# Altium project EVT_SYS_CARRIER.PrjPcb
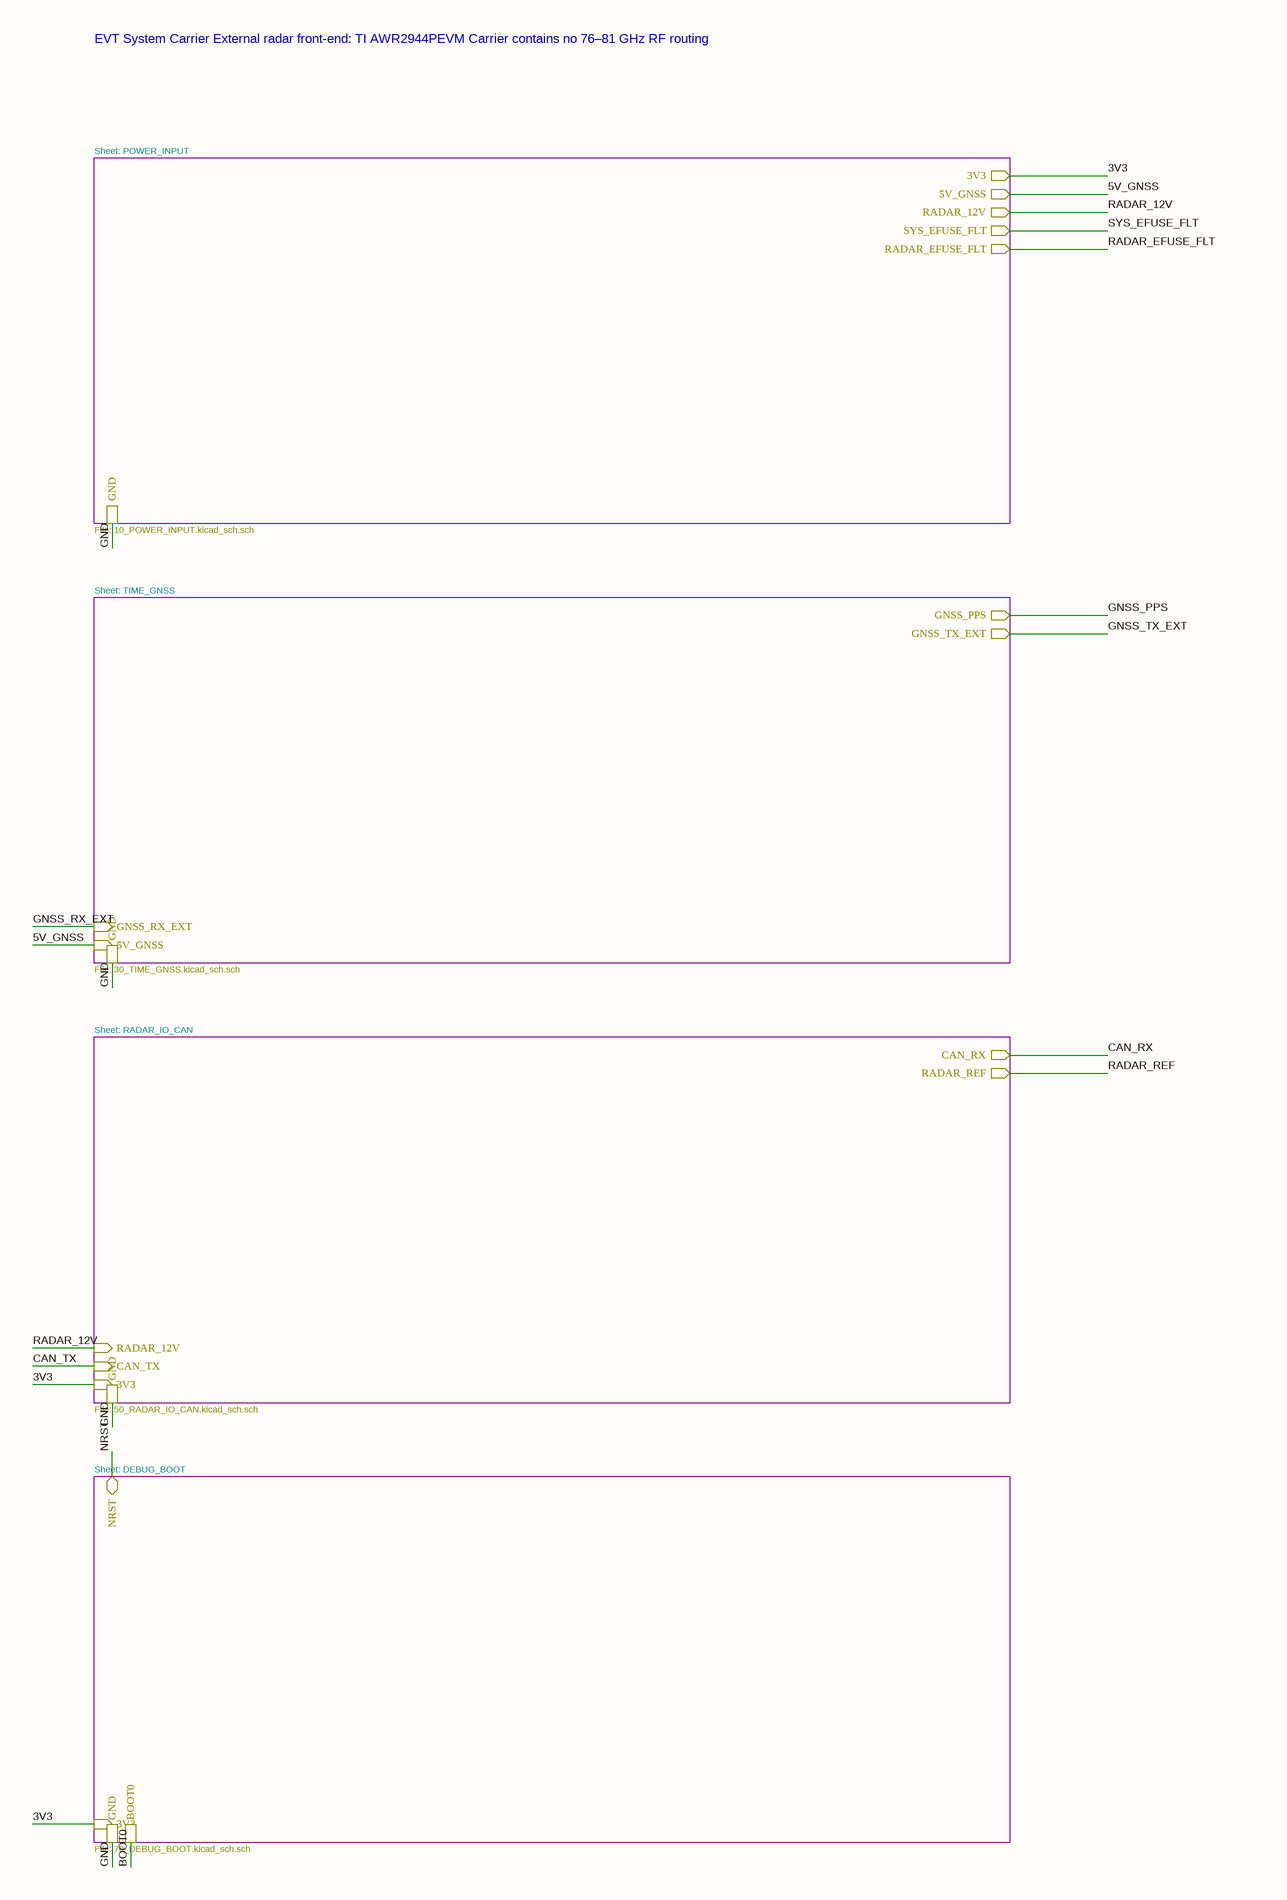
[diagram p0: EVT_SYS_CARRIER.SchDoc, left]
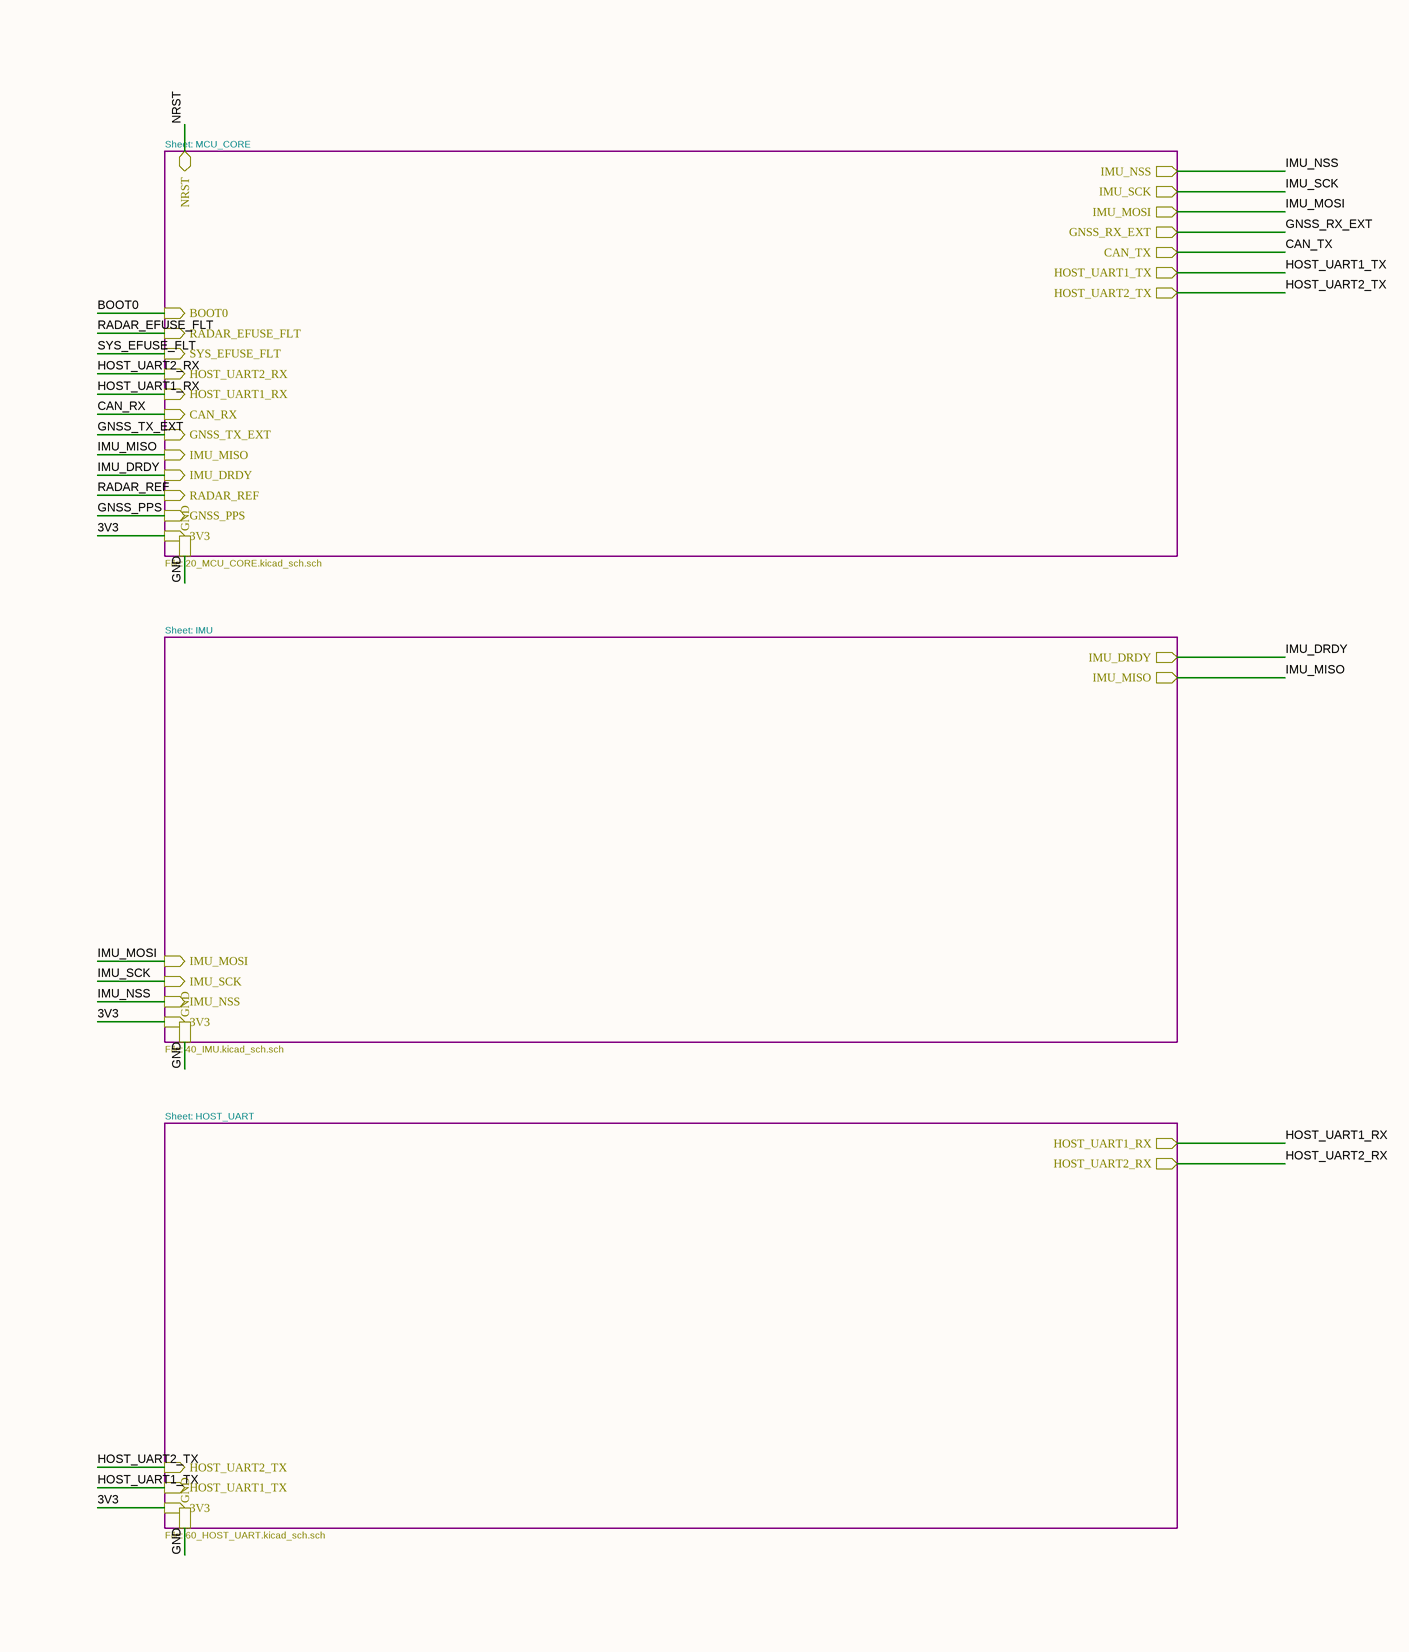
[diagram p1: EVT_SYS_CARRIER.SchDoc, right]
8 sheets, 112 parts. Net scope: hierarchical (ports join the sheet entries above them; power ports are global).
Board file: EVT_SYS_CARRIER.PcbDoc
Sheets:
  EVT_SYS_CARRIER.SchDoc
    POWER_INPUT = 10_POWER_INPUT.SchDoc
    MCU_CORE = 20_MCU_CORE.SchDoc
    TIME_GNSS = 30_TIME_GNSS.SchDoc
    IMU = 40_IMU.SchDoc
    RADAR_IO_CAN = 50_RADAR_IO_CAN.SchDoc
    HOST_UART = 60_HOST_UART.SchDoc
    DEBUG_BOOT = 70_DEBUG_BOOT.SchDoc

## Sheet EVT_SYS_CARRIER.SchDoc
size 594 x 420 mm

### Sub-sheets
DEBUG_BOOT = 70_DEBUG_BOOT.SchDoc: 3V3 (in), GND, NRST (bidir), BOOT0
HOST_UART = 60_HOST_UART.SchDoc: 3V3 (in), GND, HOST_UART1_TX (in), HOST_UART1_RX (out), HOST_UART2_TX (in), HOST_UART2_RX (out)
IMU = 40_IMU.SchDoc: 3V3 (in), GND, IMU_DRDY (out), IMU_NSS (in), IMU_SCK (in), IMU_MISO (out), IMU_MOSI (in)
MCU_CORE = 20_MCU_CORE.SchDoc: 3V3 (in), GND, GNSS_PPS (in), RADAR_REF (in), IMU_DRDY (in), IMU_NSS (out), IMU_SCK (out), IMU_MISO (in), IMU_MOSI (out), GNSS_RX_EXT (out), GNSS_TX_EXT (in), CAN_RX (in), CAN_TX (out), HOST_UART1_TX (out), HOST_UART1_RX (in), HOST_UART2_TX (out), HOST_UART2_RX (in), SYS_EFUSE_FLT (in), RADAR_EFUSE_FLT (in), NRST (bidir), BOOT0 (in)
POWER_INPUT = 10_POWER_INPUT.SchDoc: 3V3 (out), 5V_GNSS (out), RADAR_12V (out), SYS_EFUSE_FLT (out), RADAR_EFUSE_FLT (out), GND
RADAR_IO_CAN = 50_RADAR_IO_CAN.SchDoc: 3V3 (in), GND, CAN_TX (in), CAN_RX (out), RADAR_REF (out), RADAR_12V (in)
TIME_GNSS = 30_TIME_GNSS.SchDoc: 5V_GNSS (in), GND, GNSS_PPS (out), GNSS_TX_EXT (out), GNSS_RX_EXT (in)

### Nets
3V3: sheet POWER_INPUT/3V3, sheet MCU_CORE/3V3, sheet IMU/3V3, sheet RADAR_IO_CAN/3V3, sheet HOST_UART/3V3, sheet DEBUG_BOOT/3V3
5V_GNSS: sheet POWER_INPUT/5V_GNSS, sheet TIME_GNSS/5V_GNSS
BOOT0: sheet MCU_CORE/BOOT0, sheet DEBUG_BOOT/BOOT0
CAN_RX: sheet MCU_CORE/CAN_RX, sheet RADAR_IO_CAN/CAN_RX
CAN_TX: sheet MCU_CORE/CAN_TX, sheet RADAR_IO_CAN/CAN_TX
GND: sheet POWER_INPUT/GND, sheet MCU_CORE/GND, sheet TIME_GNSS/GND, sheet IMU/GND, sheet RADAR_IO_CAN/GND, sheet HOST_UART/GND, sheet DEBUG_BOOT/GND
GNSS_PPS: sheet MCU_CORE/GNSS_PPS, sheet TIME_GNSS/GNSS_PPS
GNSS_RX_EXT: sheet MCU_CORE/GNSS_RX_EXT, sheet TIME_GNSS/GNSS_RX_EXT
GNSS_TX_EXT: sheet MCU_CORE/GNSS_TX_EXT, sheet TIME_GNSS/GNSS_TX_EXT
HOST_UART1_RX: sheet MCU_CORE/HOST_UART1_RX, sheet HOST_UART/HOST_UART1_RX
HOST_UART1_TX: sheet MCU_CORE/HOST_UART1_TX, sheet HOST_UART/HOST_UART1_TX
HOST_UART2_RX: sheet MCU_CORE/HOST_UART2_RX, sheet HOST_UART/HOST_UART2_RX
HOST_UART2_TX: sheet MCU_CORE/HOST_UART2_TX, sheet HOST_UART/HOST_UART2_TX
IMU_DRDY: sheet MCU_CORE/IMU_DRDY, sheet IMU/IMU_DRDY
IMU_MISO: sheet MCU_CORE/IMU_MISO, sheet IMU/IMU_MISO
IMU_MOSI: sheet MCU_CORE/IMU_MOSI, sheet IMU/IMU_MOSI
IMU_NSS: sheet MCU_CORE/IMU_NSS, sheet IMU/IMU_NSS
IMU_SCK: sheet MCU_CORE/IMU_SCK, sheet IMU/IMU_SCK
NRST: sheet MCU_CORE/NRST, sheet DEBUG_BOOT/NRST
RADAR_12V: sheet POWER_INPUT/RADAR_12V, sheet RADAR_IO_CAN/RADAR_12V
RADAR_EFUSE_FLT: sheet POWER_INPUT/RADAR_EFUSE_FLT, sheet MCU_CORE/RADAR_EFUSE_FLT
RADAR_REF: sheet MCU_CORE/RADAR_REF, sheet RADAR_IO_CAN/RADAR_REF
SYS_EFUSE_FLT: sheet POWER_INPUT/SYS_EFUSE_FLT, sheet MCU_CORE/SYS_EFUSE_FLT

### Notes on the sheet
- EVT System Carrier
  External radar front-end: TI AWR2944PEVM
  Carrier contains no 76–81 GHz RF routing
- Sheet: POWER_INPUT
- Sheet: MCU_CORE
- File: 10_POWER_INPUT.kicad_sch.sch
- File: 20_MCU_CORE.kicad_sch.sch
- Sheet: TIME_GNSS
- Sheet: IMU
- File: 30_TIME_GNSS.kicad_sch.sch
- File: 40_IMU.kicad_sch.sch
- Sheet: RADAR_IO_CAN
- Sheet: HOST_UART
- File: 50_RADAR_IO_CAN.kicad_sch.sch
- File: 60_HOST_UART.kicad_sch.sch
- Sheet: DEBUG_BOOT
- File: 70_DEBUG_BOOT.kicad_sch.sch
- 1
- 2
- 3
- 4
- 5
- 6
- 7
- 8
- 9
- 10
- 11
- A
- B
- C
- D
- E
- F
- G
- H
- Title: EVT_SYS_CARRIER
- File: EVT_SYS_CARRIER.kicad_sch
- Sheet: /
- KiCad E.D.A.  kicad (5.1.4)-1
- Size: A2
- Date:
- Rev:
- Id: 1/1

## Sheet 10_POWER_INPUT.SchDoc
size 420 x 297 mm
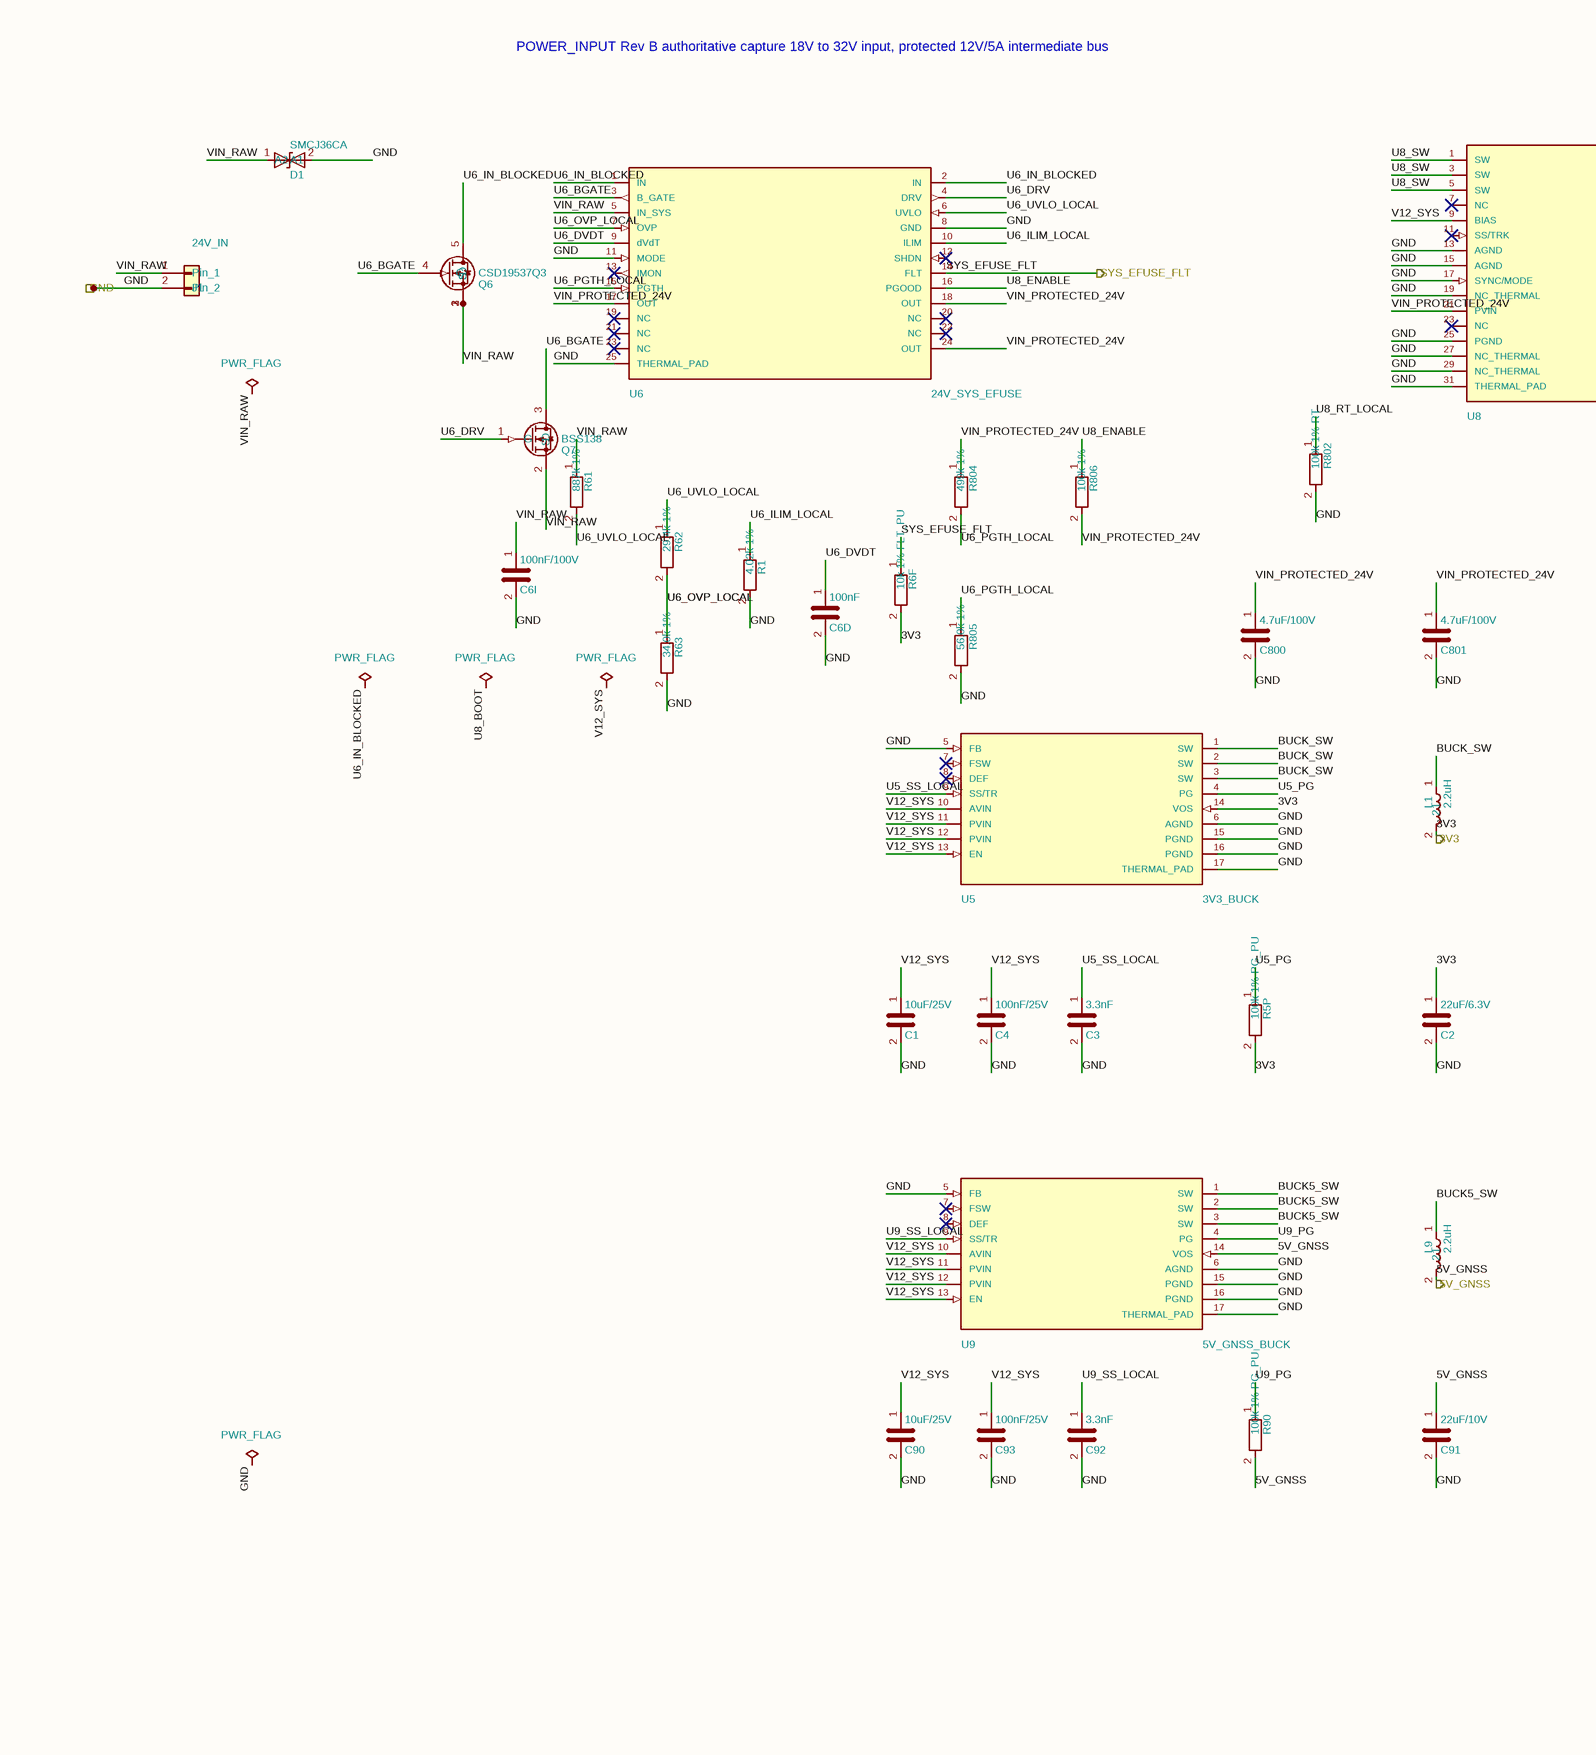
[diagram p2: 10_POWER_INPUT.SchDoc, left]
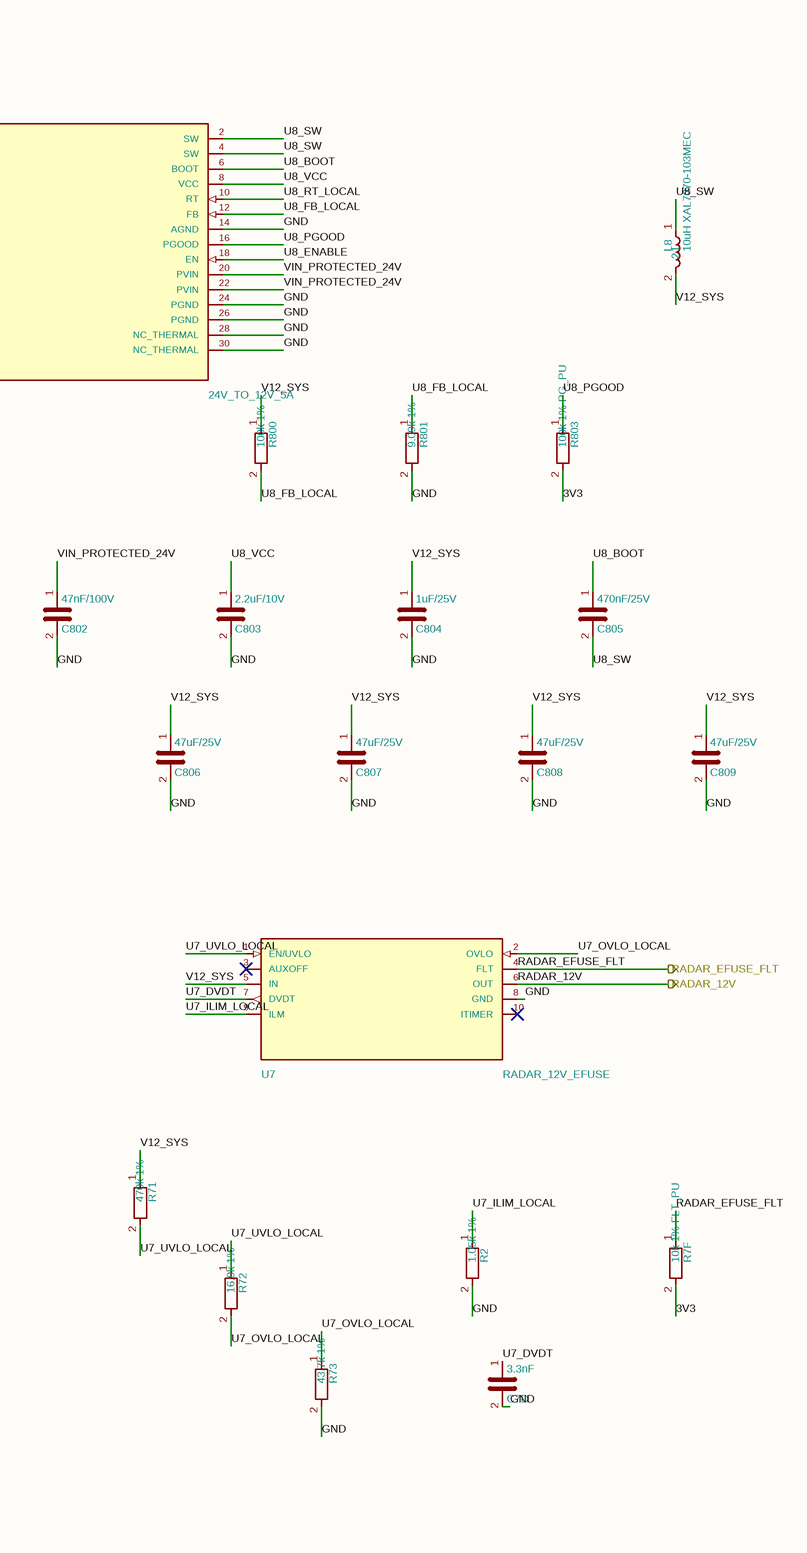
[diagram p3: 10_POWER_INPUT.SchDoc, right]

### Parts
#FLG0201  PWR_FLAG  (graphical)
#FLG0202  PWR_FLAG  (graphical)
#FLG0203  PWR_FLAG  (graphical)
#FLG0204  PWR_FLAG  (graphical)
#FLG0205  PWR_FLAG  (graphical)
C1  10uF/25V  [C_1206_3216Metric]
C2  22uF/6.3V  [C_1206_3216Metric]
C3  3.3nF  [C_0603_1608Metric]
C4  100nF/25V  [C_0603_1608Metric]
C6D  100nF  [C_0603_1608Metric]
C6I  100nF/100V  [C_0603_1608Metric]
C7D  3.3nF  [C_0603_1608Metric]
C90  10uF/25V  [C_1206_3216Metric]
C91  22uF/10V  [C_1206_3216Metric]
C92  3.3nF  [C_0603_1608Metric]
C93  100nF/25V  [C_0603_1608Metric]
C800  4.7uF/100V  [C_1210_3225Metric]
C801  4.7uF/100V  [C_1210_3225Metric]
C802  47nF/100V  [C_0603_1608Metric]
C803  2.2uF/10V  [C_0603_1608Metric]
C804  1uF/25V  [C_0603_1608Metric]
C805  470nF/25V  [C_0603_1608Metric]
C806  47uF/25V  [C_1210_3225Metric]
C807  47uF/25V  [C_1210_3225Metric]
C808  47uF/25V  [C_1210_3225Metric]
C809  47uF/25V  [C_1210_3225Metric]
D1  SMCJ36CA  [D_SMC]
J1  24V_IN  [Molex_43650-0200_RA_THT_2P]
L1  2.2uH  [Coilcraft_XFL4020_4x4]
L8  10uH XAL7070-103MEC  [L_Coilcraft_XAL7070-XXX]
L9  2.2uH  [Coilcraft_XFL4020_4x4]
Q6  CSD19537Q3  [VSON-8_3.3x3.3mm_P0.65mm_NexFET]
Q7  BSS138  [SOT-23]
R1  4.02k 1%  [R_0603_1608Metric]
R2  1.05k 1%  [R_0603_1608Metric]
R5P  100k 1% PG_PU  [R_0603_1608Metric]
R6F  10k 1% FLT_PU  [R_0603_1608Metric]
R7F  10k 1% FLT_PU  [R_0603_1608Metric]
R61  887k 1%  [R_0603_1608Metric]
R62  29.4k 1%  [R_0603_1608Metric]
R63  34.0k 1%  [R_0603_1608Metric]
R71  470k 1%  [R_0603_1608Metric]
R72  16.9k 1%  [R_0603_1608Metric]
R73  43.7k 1%  [R_0603_1608Metric]
R90  100k 1% PG_PU  [R_0603_1608Metric]
R800  100k 1%  [R_0603_1608Metric]
R801  9.09k 1%  [R_0603_1608Metric]
R802  100k 1% RT  [R_0603_1608Metric]
R803  100k 1% PG_PU  [R_0603_1608Metric]
R804  499k 1%  [R_0603_1608Metric]
R805  56.0k 1%  [R_0603_1608Metric]
R806  100k 1%  [R_0603_1608Metric]
U5  3V3_BUCK  [VQFN-16-1EP_3x3mm_P0.5mm_EP1.68x1.68mm]
U6  24V_SYS_EFUSE  [Texas_RGE0024C_VQFN-24-1EP_4x4mm_P0.5mm_EP2.1x2.1mm]
U7  RADAR_12V_EFUSE  [TPS259470A_RPW0010A_VQFN-HR-10_2x2mm_P0.475mm]
U8  24V_TO_12V_5A  [Texas_RNP0030B_WQFN-30-1EP_4x6mm_P0.5mm_EP1.8x4.5mm_ThermalVias]
U9  5V_GNSS_BUCK  [VQFN-16-1EP_3x3mm_P0.5mm_EP1.68x1.68mm]

### Ports
3V3 (out), 5V_GNSS (out), GND, RADAR_12V (out), RADAR_EFUSE_FLT (out), SYS_EFUSE_FLT (out)

### Nets
3V3: C2.1 L1.2 R5P.2 R6F.2 R7F.2 R803.2 U5.14(VOS) ; port 3V3
5V_GNSS: C91.1 L9.2 R90.2 U9.14(VOS) ; port 5V_GNSS
BUCK5_SW: L9.1 U9.1(SW) U9.2(SW) U9.3(SW)
BUCK_SW: L1.1 U5.1(SW) U5.2(SW) U5.3(SW)
GND: #FLG0202.1 C1.2 C2.2 C3.2 C4.2 C6D.2 C6I.2 C7D.2 C90.2 C91.2 C92.2 C93.2 C800.2 C801.2 C802.2 C803.2 C804.2 C806.2 C807.2 C808.2 C809.2 D1.2(A2) J1.2(Pin_2) R1.2 R2.2 R63.2 R73.2 R801.2 R802.2 R805.2 U5.5(FB) U5.6(AGND) U5.15(PGND) U5.16(PGND) U5.17(THERMAL_PAD) U6.8(GND) U6.11(MODE) U6.25(THERMAL_PAD) U7.8(GND) U8.13(AGND) U8.14(AGND) U8.15(AGND) U8.17(SYNC/MODE) U8.19(NC_THERMAL) U8.24(PGND) U8.25(PGND) U8.26(PGND) U8.27(NC_THERMAL) U8.28(NC_THERMAL) U8.29(NC_THERMAL) U8.30(NC_THERMAL) U8.31(THERMAL_PAD) U9.5(FB) U9.6(AGND) U9.15(PGND) U9.16(PGND) U9.17(THERMAL_PAD) ; port GND
RADAR_12V: U7.6(OUT) ; port RADAR_12V
RADAR_EFUSE_FLT: R7F.1 U7.4(FLT) ; port RADAR_EFUSE_FLT
SYS_EFUSE_FLT: R6F.1 U6.14(FLT) ; port SYS_EFUSE_FLT
U5_PG: R5P.1 U5.4(PG)
U5_SS_LOCAL: C3.1 U5.9(SS/TR)
U6_BGATE: Q6.4(G) Q7.3(D) U6.3(B_GATE)
U6_DRV: Q7.1(G) U6.4(DRV)
U6_DVDT: C6D.1 U6.9(dVdT)
U6_ILIM_LOCAL: R1.1 U6.10(ILIM)
U6_IN_BLOCKED: #FLG0203.1 Q6.5(D) U6.1(IN) U6.2(IN)
U6_OVP_LOCAL: R62.2 R63.1 U6.7(OVP)
U6_PGTH_LOCAL: R804.2 R805.1 U6.15(PGTH)
U6_UVLO_LOCAL: R61.2 R62.1 U6.6(UVLO)
U7_DVDT: C7D.1 U7.7(DVDT)
U7_ILIM_LOCAL: R2.1 U7.9(ILM)
U7_OVLO_LOCAL: R72.2 R73.1 U7.2(OVLO)
U7_UVLO_LOCAL: R71.2 R72.1 U7.1(EN/UVLO)
U8_BOOT: #FLG0204.1 C805.1 U8.6(BOOT)
U8_ENABLE: R806.1 U6.16(PGOOD) U8.18(EN)
U8_FB_LOCAL: R800.2 R801.1 U8.12(FB)
U8_PGOOD: R803.1 U8.16(PGOOD)
U8_RT_LOCAL: R802.1 U8.10(RT)
U8_SW: C805.2 L8.1 U8.1(SW) U8.2(SW) U8.3(SW) U8.4(SW) U8.5(SW)
U8_VCC: C803.1 U8.8(VCC)
U9_PG: R90.1 U9.4(PG)
U9_SS_LOCAL: C92.1 U9.9(SS/TR)
V12_SYS: #FLG0205.1 C1.1 C4.1 C90.1 C93.1 C804.1 C806.1 C807.1 C808.1 C809.1 L8.2 R71.1 R800.1 U5.10(AVIN) U5.11(PVIN) U5.12(PVIN) U5.13(EN) U7.5(IN) U8.9(BIAS) U9.10(AVIN) U9.11(PVIN) U9.12(PVIN) U9.13(EN)
VIN_PROTECTED_24V: C800.1 C801.1 C802.1 R804.1 R806.2 U6.17(OUT) U6.18(OUT) U6.24(OUT) U8.20(PVIN) U8.21(PVIN) U8.22(PVIN)
VIN_RAW: #FLG0201.1 C6I.1 D1.1(A1) J1.1(Pin_1) Q6.1(S) Q6.2(S) Q6.3(S) Q7.2(S) R61.1 U6.5(IN_SYS)

Not connected (* = marked no-connect by the designer): U5 7(FSW)* 8(DEF)*; U6 12(SHDN)* 13(IMON)* 19(NC)* 20(NC)* 21(NC)* 22(NC)* 23(NC)*; U7 3(AUXOFF)* 10(ITIMER)*; U8 7(NC)* 11(SS/TRK)* 23(NC)*; U9 7(FSW)* 8(DEF)*

### Notes on the sheet
- POWER_INPUT Rev B authoritative capture
  18V to 32V input, protected 12V/5A intermediate bus
- 1
- 2
- 3
- 4
- 5
- 6
- 7
- 8
- A
- B
- C
- D
- E
- Title: EVT_SYS_CARRIER
- File: 10_POWER_INPUT.kicad_sch
- Sheet: /
- F
- KiCad E.D.A.  kicad (5.1.4)-1
- Size: A3
- Date:
- Rev:
- Id: 1/1

### Library data of the parts
#FLG0201 #FLG0202 #FLG0203 #FLG0204 #FLG0205 = PWR_FLAG: hierarchy_path: /66980d89-56fb-4772-93a7-06a61d388399/6dd53468-99c2-4197-8bec-3687fb851dcd; Value: PWR_FLAG
C1 C90 = C: MPN: 10uF_25V_X7R; hierarchy_path: /66980d89-56fb-4772-93a7-06a61d388399/6dd53468-99c2-4197-8bec-3687fb851dcd; Value: 10uF/25V; Footprint: Capacitor_SMD:C_1206_3216Metric
C2 = C: MPN: 22uF_6.3V_X7R; hierarchy_path: /66980d89-56fb-4772-93a7-06a61d388399/6dd53468-99c2-4197-8bec-3687fb851dcd; Value: 22uF/6.3V; Footprint: Capacitor_SMD:C_1206_3216Metric
C3 C7D C92 = C: MPN: 3.3nF_X7R; hierarchy_path: /66980d89-56fb-4772-93a7-06a61d388399/6dd53468-99c2-4197-8bec-3687fb851dcd; Value: 3.3nF; Footprint: Capacitor_SMD:C_0603_1608Metric
C4 C6D C93 = C: MPN: 100nF_25V_X7R; hierarchy_path: /66980d89-56fb-4772-93a7-06a61d388399/6dd53468-99c2-4197-8bec-3687fb851dcd; Footprint: Capacitor_SMD:C_0603_1608Metric
  C4 C93: Value: 100nF/25V
  C6D: Value: 100nF
C6I = C: MPN: 100nF_100V_X7R; hierarchy_path: /66980d89-56fb-4772-93a7-06a61d388399/6dd53468-99c2-4197-8bec-3687fb851dcd; Value: 100nF/100V; Footprint: Capacitor_SMD:C_0603_1608Metric
C91 = C: MPN: 22uF_10V_X7R; hierarchy_path: /66980d89-56fb-4772-93a7-06a61d388399/6dd53468-99c2-4197-8bec-3687fb851dcd; Value: 22uF/10V; Footprint: Capacitor_SMD:C_1206_3216Metric
C800 C801 = C: MPN: C3225X7S2A475K200AB; hierarchy_path: /66980d89-56fb-4772-93a7-06a61d388399/6dd53468-99c2-4197-8bec-3687fb851dcd; Value: 4.7uF/100V; Footprint: Capacitor_SMD:C_1210_3225Metric
C802 = C: MPN: 47nF_100V_X7R; hierarchy_path: /66980d89-56fb-4772-93a7-06a61d388399/6dd53468-99c2-4197-8bec-3687fb851dcd; Value: 47nF/100V; Footprint: Capacitor_SMD:C_0603_1608Metric
C803 = C: MPN: 2.2uF_10V_X7R; hierarchy_path: /66980d89-56fb-4772-93a7-06a61d388399/6dd53468-99c2-4197-8bec-3687fb851dcd; Value: 2.2uF/10V; Footprint: Capacitor_SMD:C_0603_1608Metric
C804 = C: MPN: 1uF_25V_X7R; hierarchy_path: /66980d89-56fb-4772-93a7-06a61d388399/6dd53468-99c2-4197-8bec-3687fb851dcd; Value: 1uF/25V; Footprint: Capacitor_SMD:C_0603_1608Metric
C805 = C: MPN: 470nF_25V_X7R; hierarchy_path: /66980d89-56fb-4772-93a7-06a61d388399/6dd53468-99c2-4197-8bec-3687fb851dcd; Value: 470nF/25V; Footprint: Capacitor_SMD:C_0603_1608Metric
C806-C809 = C: MPN: 47uF_25V_X7R; hierarchy_path: /66980d89-56fb-4772-93a7-06a61d388399/6dd53468-99c2-4197-8bec-3687fb851dcd; Value: 47uF/25V; Footprint: Capacitor_SMD:C_1210_3225Metric
D1 = D_TVS: hierarchy_path: /66980d89-56fb-4772-93a7-06a61d388399/6dd53468-99c2-4197-8bec-3687fb851dcd; MPN: SMCJ36CA; Value: SMCJ36CA; Footprint: Diode_SMD:D_SMC
J1 = Conn_01x02: MPN: 43650-0200; hierarchy_path: /66980d89-56fb-4772-93a7-06a61d388399/6dd53468-99c2-4197-8bec-3687fb851dcd; Value: 24V_IN; Footprint: SystemCarrier_Altium:Molex_43650-0200_RA_THT_2P
L1 L9 = L: MPN: XFL4020-222MEC; hierarchy_path: /66980d89-56fb-4772-93a7-06a61d388399/6dd53468-99c2-4197-8bec-3687fb851dcd; Value: 2.2uH; Footprint: SystemCarrier_Altium:Coilcraft_XFL4020_4x4
L8 = L: hierarchy_path: /66980d89-56fb-4772-93a7-06a61d388399/6dd53468-99c2-4197-8bec-3687fb851dcd; MPN: XAL7070-103MEC; Value: 10uH XAL7070-103MEC; Footprint: Inductor_SMD:L_Coilcraft_XAL7070-XXX
Q6 = CSD19537Q3: hierarchy_path: /66980d89-56fb-4772-93a7-06a61d388399/6dd53468-99c2-4197-8bec-3687fb851dcd; MPN: CSD19537Q3; Value: CSD19537Q3; Footprint: Package_SON:VSON-8_3.3x3.3mm_P0.65mm_NexFET
Q7 = BSS138: hierarchy_path: /66980d89-56fb-4772-93a7-06a61d388399/6dd53468-99c2-4197-8bec-3687fb851dcd; MPN: BSS138; Value: BSS138; Footprint: Package_TO_SOT_SMD:SOT-23
R1 = R: MPN: 4.02k_1%; hierarchy_path: /66980d89-56fb-4772-93a7-06a61d388399/6dd53468-99c2-4197-8bec-3687fb851dcd; Value: 4.02k 1%; Footprint: Resistor_SMD:R_0603_1608Metric
R2 = R: MPN: 1.05k_1%; hierarchy_path: /66980d89-56fb-4772-93a7-06a61d388399/6dd53468-99c2-4197-8bec-3687fb851dcd; Value: 1.05k 1%; Footprint: Resistor_SMD:R_0603_1608Metric
R5P R90 R800 R802 R803 R806 = R: MPN: 100k_1%; hierarchy_path: /66980d89-56fb-4772-93a7-06a61d388399/6dd53468-99c2-4197-8bec-3687fb851dcd; Footprint: Resistor_SMD:R_0603_1608Metric
  R5P R90 R803: Value: 100k 1% PG_PU
  R800 R806: Value: 100k 1%
  R802: Value: 100k 1% RT
R6F R7F = R: MPN: 10k_1%; hierarchy_path: /66980d89-56fb-4772-93a7-06a61d388399/6dd53468-99c2-4197-8bec-3687fb851dcd; Value: 10k 1% FLT_PU; Footprint: Resistor_SMD:R_0603_1608Metric
R61 = R: MPN: 887k_1%; hierarchy_path: /66980d89-56fb-4772-93a7-06a61d388399/6dd53468-99c2-4197-8bec-3687fb851dcd; Value: 887k 1%; Footprint: Resistor_SMD:R_0603_1608Metric
R62 = R: MPN: 29.4k_1%; hierarchy_path: /66980d89-56fb-4772-93a7-06a61d388399/6dd53468-99c2-4197-8bec-3687fb851dcd; Value: 29.4k 1%; Footprint: Resistor_SMD:R_0603_1608Metric
R63 = R: MPN: 34.0k_1%; hierarchy_path: /66980d89-56fb-4772-93a7-06a61d388399/6dd53468-99c2-4197-8bec-3687fb851dcd; Value: 34.0k 1%; Footprint: Resistor_SMD:R_0603_1608Metric
R71 = R: MPN: 470k_1%; hierarchy_path: /66980d89-56fb-4772-93a7-06a61d388399/6dd53468-99c2-4197-8bec-3687fb851dcd; Value: 470k 1%; Footprint: Resistor_SMD:R_0603_1608Metric
R72 = R: MPN: 16.9k_1%; hierarchy_path: /66980d89-56fb-4772-93a7-06a61d388399/6dd53468-99c2-4197-8bec-3687fb851dcd; Value: 16.9k 1%; Footprint: Resistor_SMD:R_0603_1608Metric
R73 = R: MPN: 43.7k_1%; hierarchy_path: /66980d89-56fb-4772-93a7-06a61d388399/6dd53468-99c2-4197-8bec-3687fb851dcd; Value: 43.7k 1%; Footprint: Resistor_SMD:R_0603_1608Metric
R801 = R: MPN: 9.09k_1%; hierarchy_path: /66980d89-56fb-4772-93a7-06a61d388399/6dd53468-99c2-4197-8bec-3687fb851dcd; Value: 9.09k 1%; Footprint: Resistor_SMD:R_0603_1608Metric
R804 = R: MPN: 499k_1%; hierarchy_path: /66980d89-56fb-4772-93a7-06a61d388399/6dd53468-99c2-4197-8bec-3687fb851dcd; Value: 499k 1%; Footprint: Resistor_SMD:R_0603_1608Metric
R805 = R: MPN: 56.0k_1%; hierarchy_path: /66980d89-56fb-4772-93a7-06a61d388399/6dd53468-99c2-4197-8bec-3687fb851dcd; Value: 56.0k 1%; Footprint: Resistor_SMD:R_0603_1608Metric
U5 = TPS62132RGTR: Capture_Status: LOCAL_CONTRACT_SYMBOL; hierarchy_path: /66980d89-56fb-4772-93a7-06a61d388399/6dd53468-99c2-4197-8bec-3687fb851dcd; MPN: TPS62132RGTR; Value: 3V3_BUCK; Footprint: Package_DFN_QFN:VQFN-16-1EP_3x3mm_P0.5mm_EP1.68x1.68mm
U6 = TPS26630RGER: Capture_Status: LOCAL_CONTRACT_SYMBOL; hierarchy_path: /66980d89-56fb-4772-93a7-06a61d388399/6dd53468-99c2-4197-8bec-3687fb851dcd; MPN: TPS26630RGER; Value: 24V_SYS_EFUSE; Footprint: Package_DFN_QFN:Texas_RGE0024C_VQFN-24-1EP_4x4mm_P0.5mm_EP2.1x2.1mm
U7 = TPS259470ARPWR: Capture_Status: LOCAL_CONTRACT_SYMBOL; hierarchy_path: /66980d89-56fb-4772-93a7-06a61d388399/6dd53468-99c2-4197-8bec-3687fb851dcd; MPN: TPS259470ARPWR; Value: RADAR_12V_EFUSE; Footprint: SystemCarrier_Local:TPS259470A_RPW0010A_VQFN-HR-10_2x2mm_P0.475mm
U8 = LM76005RNPR: Capture_Status: LOCAL_CONTRACT_SYMBOL; hierarchy_path: /66980d89-56fb-4772-93a7-06a61d388399/6dd53468-99c2-4197-8bec-3687fb851dcd; MPN: LM76005RNPR; Value: 24V_TO_12V_5A; Footprint: Package_DFN_QFN:Texas_RNP0030B_WQFN-30-1EP_4x6mm_P0.5mm_EP1.8x4.5mm_ThermalVias
U9 = TPS62133RGTR: Capture_Status: LOCAL_CONTRACT_SYMBOL; hierarchy_path: /66980d89-56fb-4772-93a7-06a61d388399/6dd53468-99c2-4197-8bec-3687fb851dcd; MPN: TPS62133RGTR; Value: 5V_GNSS_BUCK; Footprint: Package_DFN_QFN:VQFN-16-1EP_3x3mm_P0.5mm_EP1.68x1.68mm

## Sheet 20_MCU_CORE.SchDoc
size 420 x 297 mm
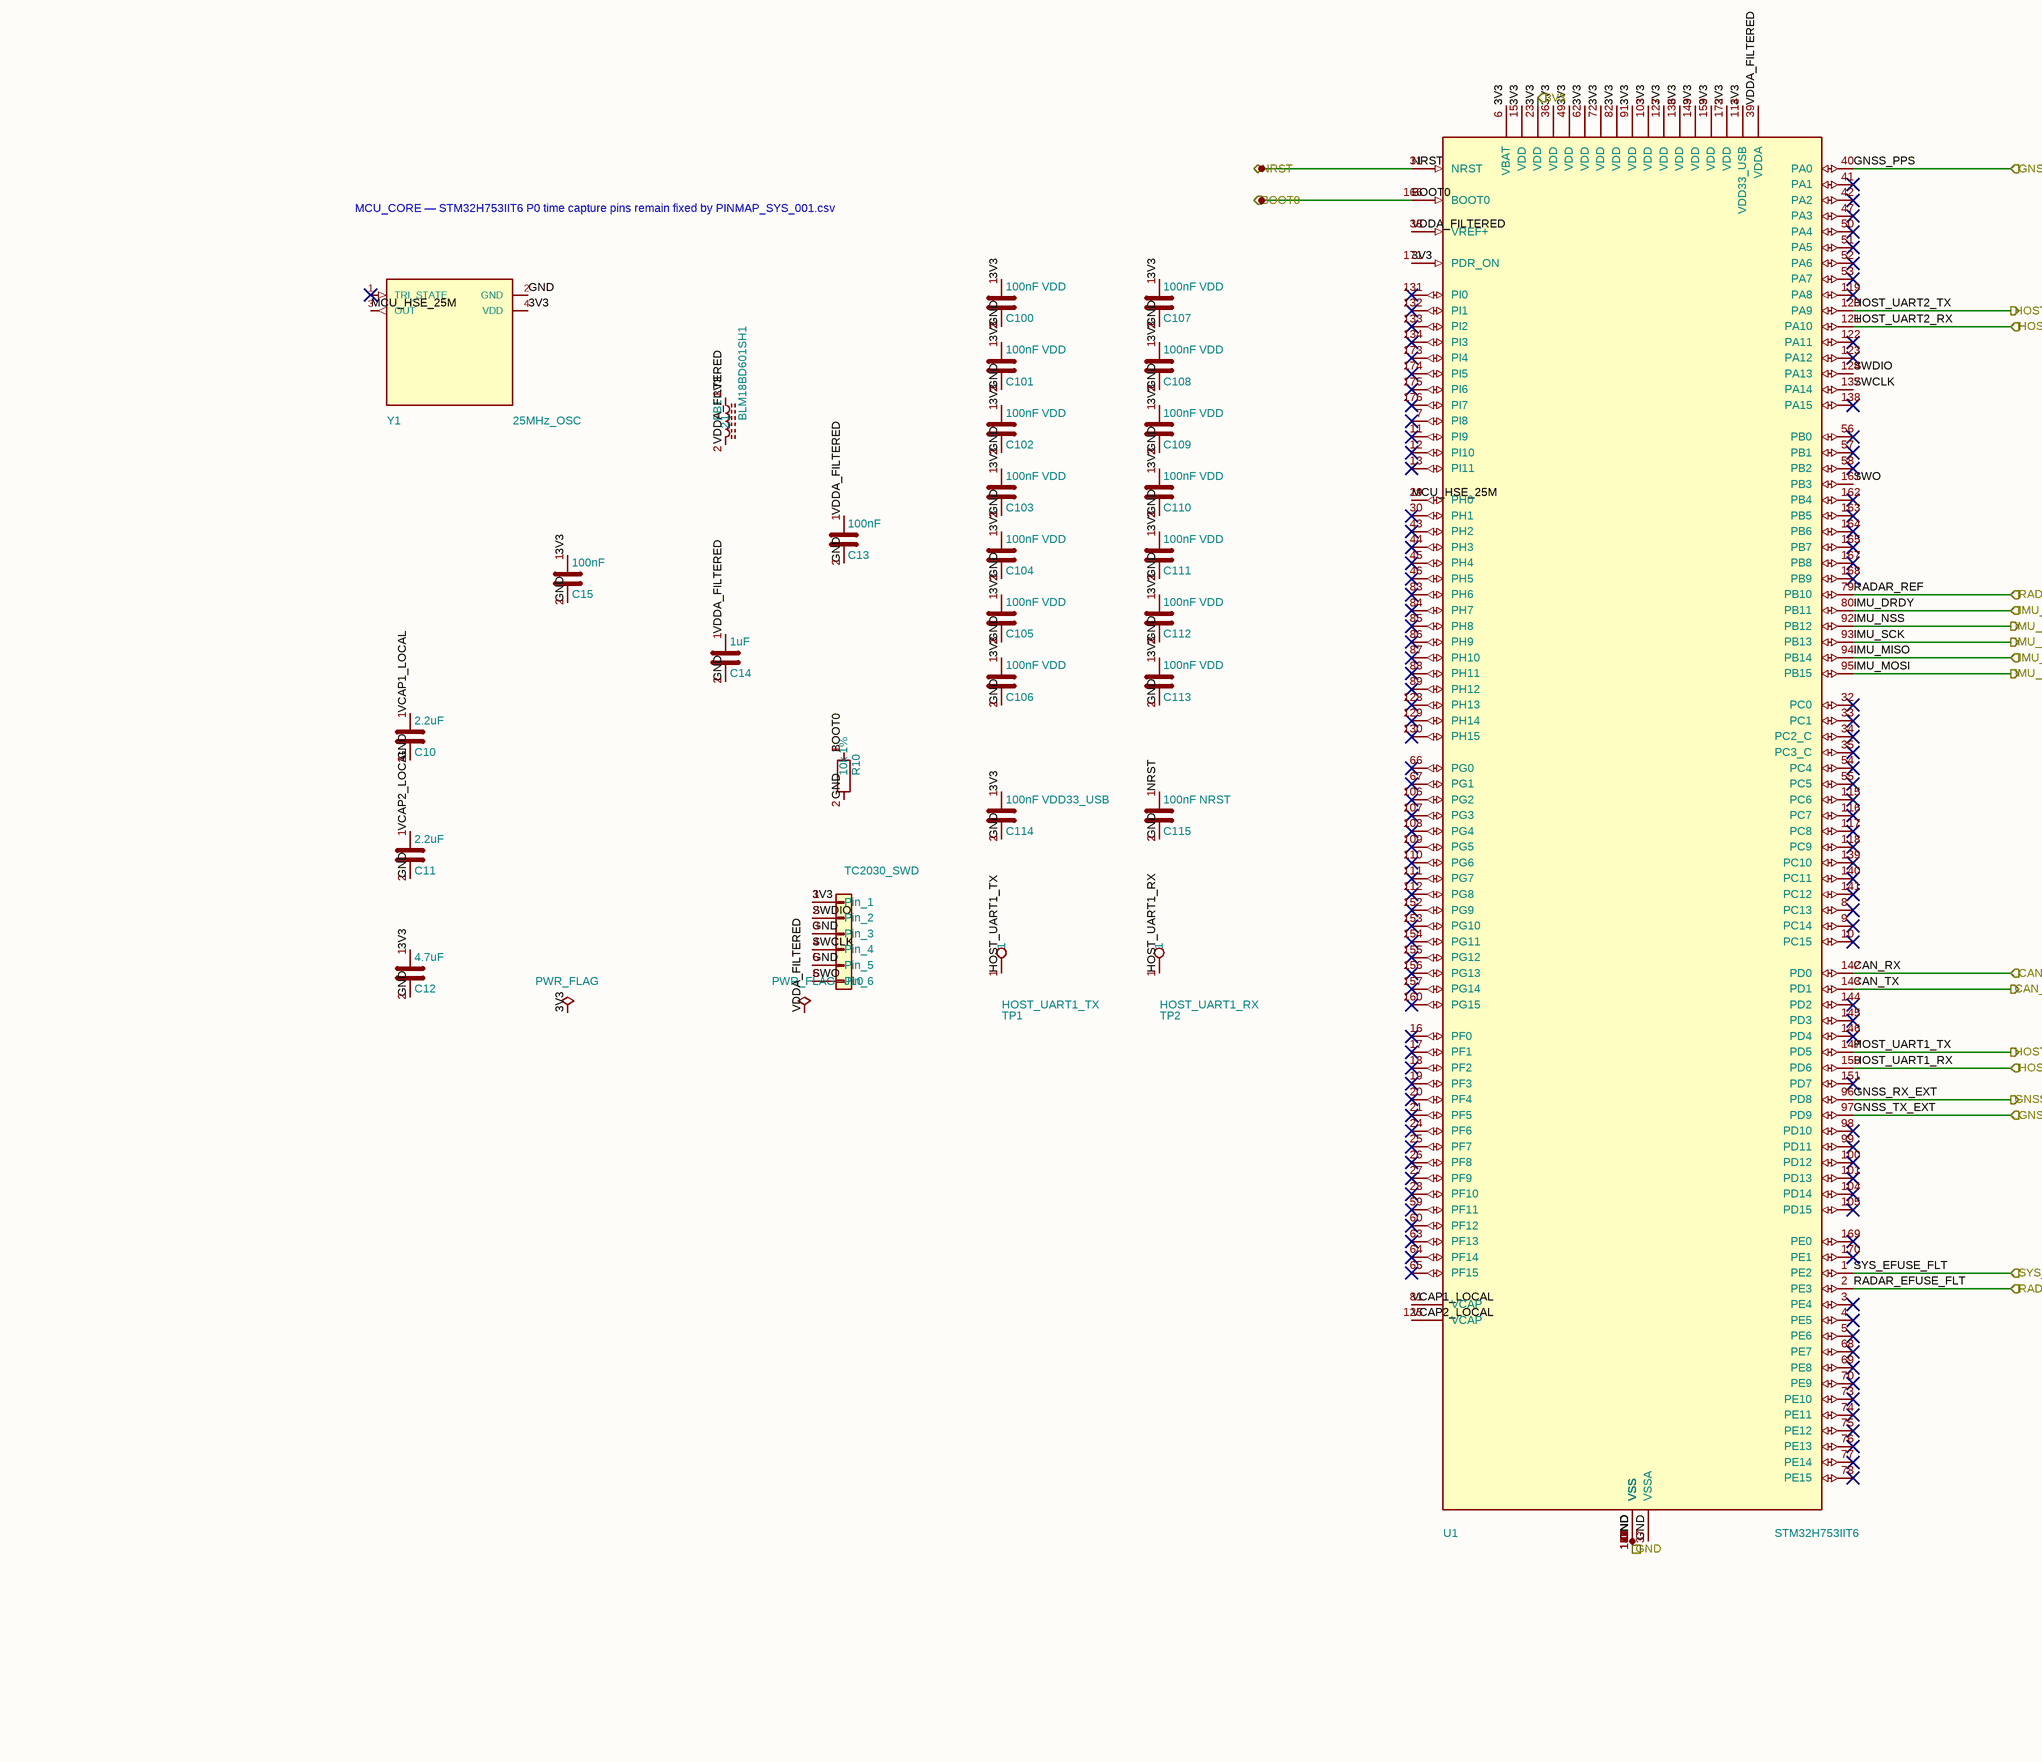
[diagram p4: 20_MCU_CORE.SchDoc]

### Parts
#FLG0101  PWR_FLAG  (graphical)
#FLG0103  PWR_FLAG  (graphical)
C10  2.2uF  [C_0603_1608Metric]
C11  2.2uF  [C_0603_1608Metric]
C12  4.7uF  [C_0805_2012Metric]
C13  100nF  [C_0402_1005Metric]
C14  1uF  [C_0603_1608Metric]
C15  100nF  [C_0402_1005Metric]
C100  100nF VDD  [C_0402_1005Metric]
C101  100nF VDD  [C_0402_1005Metric]
C102  100nF VDD  [C_0402_1005Metric]
C103  100nF VDD  [C_0402_1005Metric]
C104  100nF VDD  [C_0402_1005Metric]
C105  100nF VDD  [C_0402_1005Metric]
C106  100nF VDD  [C_0402_1005Metric]
C107  100nF VDD  [C_0402_1005Metric]
C108  100nF VDD  [C_0402_1005Metric]
C109  100nF VDD  [C_0402_1005Metric]
C110  100nF VDD  [C_0402_1005Metric]
C111  100nF VDD  [C_0402_1005Metric]
C112  100nF VDD  [C_0402_1005Metric]
C113  100nF VDD  [C_0402_1005Metric]
C114  100nF VDD33_USB  [C_0402_1005Metric]
C115  100nF NRST  [C_0402_1005Metric]
FB1  BLM18BD601SH1  [L_0603_1608Metric]
J10  TC2030_SWD  [TagConnect_TC2030_NL]
R10  10k 1%  [R_0603_1608Metric]
TP1  HOST_UART1_TX  [TestPoint_Pad_D1.0mm]
TP2  HOST_UART1_RX  [TestPoint_Pad_D1.0mm]
U1  STM32H753IIT6  [LQFP-176_24x24mm_P0.5mm]
Y1  25MHz_OSC  [Oscillator_SMD_ECS_2520MV-xxx-xx-4Pin_2.5x2.0mm]

### Ports
3V3 (in), BOOT0 (in), CAN_RX (in), CAN_TX (out), GND, GNSS_PPS (in), GNSS_RX_EXT (out), GNSS_TX_EXT (in), HOST_UART1_RX (in), HOST_UART1_TX (out), HOST_UART2_RX (in), HOST_UART2_TX (out), IMU_DRDY (in), IMU_MISO (in), IMU_MOSI (out), IMU_NSS (out), IMU_SCK (out), NRST (bidir), RADAR_EFUSE_FLT (in), RADAR_REF (in), SYS_EFUSE_FLT (in)

### Nets
3V3: #FLG0101.1 C12.1 C15.1 C100.1 C101.1 C102.1 C103.1 C104.1 C105.1 C106.1 C107.1 C108.1 C109.1 C110.1 C111.1 C112.1 C113.1 C114.1 FB1.1 J10.1(Pin_1) U1.6(VBAT) U1.15(VDD) U1.23(VDD) U1.36(VDD) U1.49(VDD) U1.62(VDD) U1.72(VDD) U1.82(VDD) U1.91(VDD) U1.103(VDD) U1.114(VDD33_USB) U1.127(VDD) U1.136(VDD) U1.149(VDD) U1.159(VDD) U1.171(PDR_ON) U1.172(VDD) Y1.4(VDD) ; port 3V3
BOOT0: R10.1 U1.166(BOOT0) ; port BOOT0
CAN_RX: U1.142(PD0) ; port CAN_RX
CAN_TX: U1.143(PD1) ; port CAN_TX
GND: C10.2 C11.2 C12.2 C13.2 C14.2 C15.2 C100.2 C101.2 C102.2 C103.2 C104.2 C105.2 C106.2 C107.2 C108.2 C109.2 C110.2 C111.2 C112.2 C113.2 C114.2 C115.2 J10.3(Pin_3) J10.5(Pin_5) R10.2 U1.14(VSS) U1.22(VSS) U1.37(VSSA) U1.48(VSS) U1.61(VSS) U1.71(VSS) U1.90(VSS) U1.102(VSS) U1.113(VSS) U1.126(VSS) U1.135(VSS) U1.148(VSS) U1.158(VSS) Y1.2(GND) ; port GND
GNSS_PPS: U1.40(PA0) ; port GNSS_PPS
GNSS_RX_EXT: U1.96(PD8) ; port GNSS_RX_EXT
GNSS_TX_EXT: U1.97(PD9) ; port GNSS_TX_EXT
HOST_UART1_RX: TP2.1 U1.150(PD6) ; port HOST_UART1_RX
HOST_UART1_TX: TP1.1 U1.147(PD5) ; port HOST_UART1_TX
HOST_UART2_RX: U1.121(PA10) ; port HOST_UART2_RX
HOST_UART2_TX: U1.120(PA9) ; port HOST_UART2_TX
IMU_DRDY: U1.80(PB11) ; port IMU_DRDY
IMU_MISO: U1.94(PB14) ; port IMU_MISO
IMU_MOSI: U1.95(PB15) ; port IMU_MOSI
IMU_NSS: U1.92(PB12) ; port IMU_NSS
IMU_SCK: U1.93(PB13) ; port IMU_SCK
MCU_HSE_25M: U1.29(PH0) Y1.3(OUT)
NRST: C115.1 U1.31(NRST) ; port NRST
RADAR_EFUSE_FLT: U1.2(PE3) ; port RADAR_EFUSE_FLT
RADAR_REF: U1.79(PB10) ; port RADAR_REF
SWCLK: J10.4(Pin_4) U1.137(PA14)
SWDIO: J10.2(Pin_2) U1.124(PA13)
SWO: J10.6(Pin_6) U1.161(PB3)
SYS_EFUSE_FLT: U1.1(PE2) ; port SYS_EFUSE_FLT
VCAP1_LOCAL: C10.1 U1.81(VCAP)
VCAP2_LOCAL: C11.1 U1.125(VCAP)
VDDA_FILTERED: #FLG0103.1 C13.1 C14.1 FB1.2 U1.38(VREF+) U1.39(VDDA)

Not connected (* = marked no-connect by the designer): U1 3(PE4)* 4(PE5)* 5(PE6)* 7(PI8)* 8(PC13)* 9(PC14)* 10(PC15)* 11(PI9)* 12(PI10)* 13(PI11)* 16(PF0)* 17(PF1)* 18(PF2)* 19(PF3)* 20(PF4)* 21(PF5)* 24(PF6)* 25(PF7)* 26(PF8)* 27(PF9)* 28(PF10)* 30(PH1)* 32(PC0)* 33(PC1)* 34(PC2_C)* 35(PC3_C)* 41(PA1)* 42(PA2)* 43(PH2)* 44(PH3)* 45(PH4)* 46(PH5)* 47(PA3)* 50(PA4)* 51(PA5)* 52(PA6)* 53(PA7)* 54(PC4)* 55(PC5)* 56(PB0)* 57(PB1)* 58(PB2)* 59(PF11)* 60(PF12)* 63(PF13)* 64(PF14)* 65(PF15)* 66(PG0)* 67(PG1)* 68(PE7)* 69(PE8)* 70(PE9)* 73(PE10)* 74(PE11)* 75(PE12)* 76(PE13)* 77(PE14)* 78(PE15)* 83(PH6)* 84(PH7)* 85(PH8)* 86(PH9)* 87(PH10)* 88(PH11)* 89(PH12)* 98(PD10)* 99(PD11)* 100(PD12)* 101(PD13)* 104(PD14)* 105(PD15)* 106(PG2)* 107(PG3)* 108(PG4)* 109(PG5)* 110(PG6)* 111(PG7)* 112(PG8)* 115(PC6)* 116(PC7)* 117(PC8)* 118(PC9)* 119(PA8)* 122(PA11)* 123(PA12)* 128(PH13)* 129(PH14)* 130(PH15)* 131(PI0)* 132(PI1)* 133(PI2)* 134(PI3)* 138(PA15)* 139(PC10)* 140(PC11)* 141(PC12)* 144(PD2)* 145(PD3)* 146(PD4)* 151(PD7)* 152(PG9)* 153(PG10)* 154(PG11)* 155(PG12)* 156(PG13)* 157(PG14)* 160(PG15)* 162(PB4)* 163(PB5)* 164(PB6)* 165(PB7)* 167(PB8)* 168(PB9)* 169(PE0)* 170(PE1)* 173(PI4)* 174(PI5)* 175(PI6)* 176(PI7)*; Y1 1(TRI_STATE)*

### Notes on the sheet
- MCU_CORE — STM32H753IIT6
  P0 time capture pins remain fixed by PINMAP_SYS_001.csv
- 1
- 2
- 3
- 4
- 5
- 6
- 7
- 8
- A
- B
- C
- D
- E
- Title: EVT_SYS_CARRIER
- File: 20_MCU_CORE.kicad_sch
- Sheet: /
- F
- KiCad E.D.A.  kicad (5.1.4)-1
- Size: A3
- Date:
- Rev:
- Id: 1/1

### Library data of the parts
#FLG0101 #FLG0103 = PWR_FLAG: hierarchy_path: /66980d89-56fb-4772-93a7-06a61d388399/531916ae-7957-4d09-a2e0-18a9c70f6c21; Value: PWR_FLAG
C10 C11 = C: MPN: 2.2uF_6.3V_X7R; hierarchy_path: /66980d89-56fb-4772-93a7-06a61d388399/531916ae-7957-4d09-a2e0-18a9c70f6c21; Value: 2.2uF; Footprint: Capacitor_SMD:C_0603_1608Metric
C12 = C: MPN: 4.7uF_6.3V_X7R; hierarchy_path: /66980d89-56fb-4772-93a7-06a61d388399/531916ae-7957-4d09-a2e0-18a9c70f6c21; Value: 4.7uF; Footprint: Capacitor_SMD:C_0805_2012Metric
C13 C15 = C: MPN: 100nF_6.3V_X7R; hierarchy_path: /66980d89-56fb-4772-93a7-06a61d388399/531916ae-7957-4d09-a2e0-18a9c70f6c21; Value: 100nF; Footprint: Capacitor_SMD:C_0402_1005Metric
C14 = C: MPN: 1uF_6.3V_X7R; hierarchy_path: /66980d89-56fb-4772-93a7-06a61d388399/531916ae-7957-4d09-a2e0-18a9c70f6c21; Value: 1uF; Footprint: Capacitor_SMD:C_0603_1608Metric
C100 = C: MPN: 100nF_6.3V_X7R; Decouples_U1_Pin: 15; hierarchy_path: /66980d89-56fb-4772-93a7-06a61d388399/531916ae-7957-4d09-a2e0-18a9c70f6c21; Value: 100nF VDD; Footprint: Capacitor_SMD:C_0402_1005Metric
C101 = C: MPN: 100nF_6.3V_X7R; Decouples_U1_Pin: 23; hierarchy_path: /66980d89-56fb-4772-93a7-06a61d388399/531916ae-7957-4d09-a2e0-18a9c70f6c21; Value: 100nF VDD; Footprint: Capacitor_SMD:C_0402_1005Metric
C102 = C: MPN: 100nF_6.3V_X7R; Decouples_U1_Pin: 36; hierarchy_path: /66980d89-56fb-4772-93a7-06a61d388399/531916ae-7957-4d09-a2e0-18a9c70f6c21; Value: 100nF VDD; Footprint: Capacitor_SMD:C_0402_1005Metric
C103 = C: MPN: 100nF_6.3V_X7R; Decouples_U1_Pin: 49; hierarchy_path: /66980d89-56fb-4772-93a7-06a61d388399/531916ae-7957-4d09-a2e0-18a9c70f6c21; Value: 100nF VDD; Footprint: Capacitor_SMD:C_0402_1005Metric
C104 = C: MPN: 100nF_6.3V_X7R; Decouples_U1_Pin: 62; hierarchy_path: /66980d89-56fb-4772-93a7-06a61d388399/531916ae-7957-4d09-a2e0-18a9c70f6c21; Value: 100nF VDD; Footprint: Capacitor_SMD:C_0402_1005Metric
C105 = C: MPN: 100nF_6.3V_X7R; Decouples_U1_Pin: 72; hierarchy_path: /66980d89-56fb-4772-93a7-06a61d388399/531916ae-7957-4d09-a2e0-18a9c70f6c21; Value: 100nF VDD; Footprint: Capacitor_SMD:C_0402_1005Metric
C106 = C: MPN: 100nF_6.3V_X7R; Decouples_U1_Pin: 82; hierarchy_path: /66980d89-56fb-4772-93a7-06a61d388399/531916ae-7957-4d09-a2e0-18a9c70f6c21; Value: 100nF VDD; Footprint: Capacitor_SMD:C_0402_1005Metric
C107 = C: MPN: 100nF_6.3V_X7R; Decouples_U1_Pin: 91; hierarchy_path: /66980d89-56fb-4772-93a7-06a61d388399/531916ae-7957-4d09-a2e0-18a9c70f6c21; Value: 100nF VDD; Footprint: Capacitor_SMD:C_0402_1005Metric
C108 = C: MPN: 100nF_6.3V_X7R; Decouples_U1_Pin: 103; hierarchy_path: /66980d89-56fb-4772-93a7-06a61d388399/531916ae-7957-4d09-a2e0-18a9c70f6c21; Value: 100nF VDD; Footprint: Capacitor_SMD:C_0402_1005Metric
C109 = C: MPN: 100nF_6.3V_X7R; Decouples_U1_Pin: 127; hierarchy_path: /66980d89-56fb-4772-93a7-06a61d388399/531916ae-7957-4d09-a2e0-18a9c70f6c21; Value: 100nF VDD; Footprint: Capacitor_SMD:C_0402_1005Metric
C110 = C: MPN: 100nF_6.3V_X7R; Decouples_U1_Pin: 136; hierarchy_path: /66980d89-56fb-4772-93a7-06a61d388399/531916ae-7957-4d09-a2e0-18a9c70f6c21; Value: 100nF VDD; Footprint: Capacitor_SMD:C_0402_1005Metric
C111 = C: MPN: 100nF_6.3V_X7R; Decouples_U1_Pin: 149; hierarchy_path: /66980d89-56fb-4772-93a7-06a61d388399/531916ae-7957-4d09-a2e0-18a9c70f6c21; Value: 100nF VDD; Footprint: Capacitor_SMD:C_0402_1005Metric
C112 = C: MPN: 100nF_6.3V_X7R; Decouples_U1_Pin: 159; hierarchy_path: /66980d89-56fb-4772-93a7-06a61d388399/531916ae-7957-4d09-a2e0-18a9c70f6c21; Value: 100nF VDD; Footprint: Capacitor_SMD:C_0402_1005Metric
C113 = C: MPN: 100nF_6.3V_X7R; Decouples_U1_Pin: 172; hierarchy_path: /66980d89-56fb-4772-93a7-06a61d388399/531916ae-7957-4d09-a2e0-18a9c70f6c21; Value: 100nF VDD; Footprint: Capacitor_SMD:C_0402_1005Metric
C114 = C: MPN: 100nF_6.3V_X7R; Decouples_U1_Pin: 114; hierarchy_path: /66980d89-56fb-4772-93a7-06a61d388399/531916ae-7957-4d09-a2e0-18a9c70f6c21; Value: 100nF VDD33_USB; Footprint: Capacitor_SMD:C_0402_1005Metric
C115 = C: MPN: 100nF_6.3V_X7R; Filters_U1_Pin: 31; hierarchy_path: /66980d89-56fb-4772-93a7-06a61d388399/531916ae-7957-4d09-a2e0-18a9c70f6c21; Value: 100nF NRST; Footprint: Capacitor_SMD:C_0402_1005Metric
FB1 = L_Ferrite: hierarchy_path: /66980d89-56fb-4772-93a7-06a61d388399/531916ae-7957-4d09-a2e0-18a9c70f6c21; MPN: BLM18BD601SH1; Value: BLM18BD601SH1; Footprint: Inductor_SMD:L_0603_1608Metric
J10 = Conn_01x06: MPN: TC2030-NL_TARGET; hierarchy_path: /66980d89-56fb-4772-93a7-06a61d388399/531916ae-7957-4d09-a2e0-18a9c70f6c21; Value: TC2030_SWD; Footprint: SystemCarrier_Altium:TagConnect_TC2030_NL
R10 = R: MPN: 10k_1%; hierarchy_path: /66980d89-56fb-4772-93a7-06a61d388399/531916ae-7957-4d09-a2e0-18a9c70f6c21; Value: 10k 1%; Footprint: Resistor_SMD:R_0603_1608Metric
TP1 TP2 = TestPoint: hierarchy_path: /66980d89-56fb-4772-93a7-06a61d388399/531916ae-7957-4d09-a2e0-18a9c70f6c21; Footprint: TestPoint:TestPoint_Pad_D1.0mm
  TP1: MPN: HOST_UART1_TX; Value: HOST_UART1_TX
  TP2: MPN: HOST_UART1_RX; Value: HOST_UART1_RX
U1 = STM32H753IITx: hierarchy_path: /66980d89-56fb-4772-93a7-06a61d388399/531916ae-7957-4d09-a2e0-18a9c70f6c21; MPN: STM32H753IIT6; Value: STM32H753IIT6; Footprint: Package_QFP:LQFP-176_24x24mm_P0.5mm
Y1 = ECS-2520S33-250-FN-TR: Capture_Status: LOCAL_CONTRACT_SYMBOL; hierarchy_path: /66980d89-56fb-4772-93a7-06a61d388399/531916ae-7957-4d09-a2e0-18a9c70f6c21; MPN: ECS-2520S33-250-FN-TR; Value: 25MHz_OSC; Footprint: Oscillator:Oscillator_SMD_ECS_2520MV-xxx-xx-4Pin_2.5x2.0mm

## Sheet 30_TIME_GNSS.SchDoc
size 209 x 148 mm
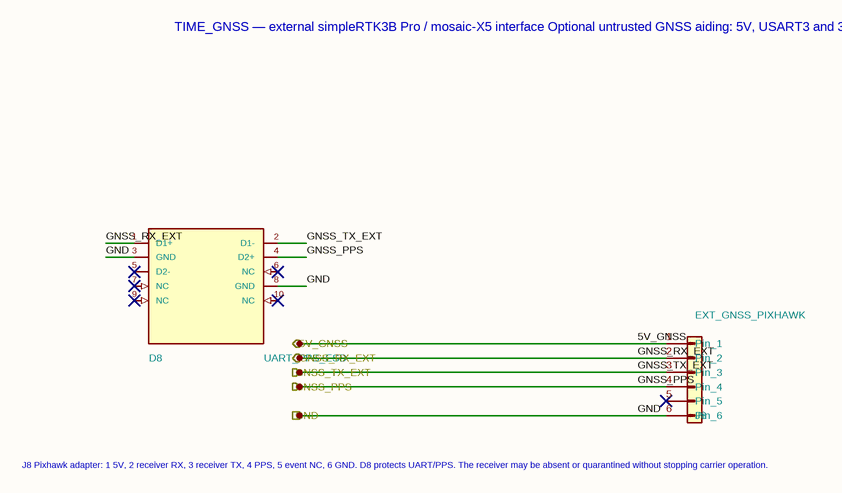
[diagram p5: 30_TIME_GNSS.SchDoc]

### Parts
D8  UART_PPS_ESD  [USON-10_2.5x1.0mm_P0.5mm]
J8  EXT_GNSS_PIXHAWK  [JST_GH_SM06B-GHS-TB_1x06-1MP_P1.25mm_Horizontal]

### Ports
5V_GNSS (in), GND, GNSS_PPS (out), GNSS_RX_EXT (in), GNSS_TX_EXT (out)

### Nets
5V_GNSS: J8.1(Pin_1) ; port 5V_GNSS
GND: D8.3(GND) D8.8(GND) J8.6(Pin_6) ; port GND
GNSS_PPS: D8.4(D2+) J8.4(Pin_4) ; port GNSS_PPS
GNSS_RX_EXT: D8.1(D1+) J8.2(Pin_2) ; port GNSS_RX_EXT
GNSS_TX_EXT: D8.2(D1-) J8.3(Pin_3) ; port GNSS_TX_EXT

Not connected (* = marked no-connect by the designer): D8 5(D2-)* 6(NC)* 7(NC)* 9(NC)* 10(NC)*; J8 5(Pin_5)*

### Notes on the sheet
- TIME_GNSS — external simpleRTK3B Pro / mosaic-X5 interface
  Optional untrusted GNSS aiding: 5V, USART3 and 3.3V PPS
- (near J8) J8 Pixhawk adapter: 1 5V, 2 receiver RX,
  3 receiver TX, 4 PPS, 5 event NC, 6 GND.
  D8 protects UART/PPS. The receiver may be absent
  or quarantined without stopping carrier operation.
- 1
- 2
- 3
- 4
- A
- B
- Title: EVT_SYS_CARRIER
- File: 30_TIME_GNSS.kicad_sch
- Sheet: /
- C
- KiCad E.D.A.  kicad (5.1.4)-1
- Size: A5
- Date:
- Rev:
- Id: 1/1

### Library data of the parts
D8 = TPD4E05U06DQAR: Capture_Status: LOCAL_CONTRACT_SYMBOL; hierarchy_path: /66980d89-56fb-4772-93a7-06a61d388399/9c5f5607-c07c-4d34-adbd-36601c2debbf; MPN: TPD4E05U06DQAR; Value: UART_PPS_ESD; Footprint: Package_SON:USON-10_2.5x1.0mm_P0.5mm
J8 = Conn_01x06: MPN: SM06B-GHS-TB(LF)(SN); hierarchy_path: /66980d89-56fb-4772-93a7-06a61d388399/9c5f5607-c07c-4d34-adbd-36601c2debbf; Value: EXT_GNSS_PIXHAWK; Footprint: Connector_JST:JST_GH_SM06B-GHS-TB_1x06-1MP_P1.25mm_Horizontal

## Sheet 40_IMU.SchDoc
size 209 x 148 mm
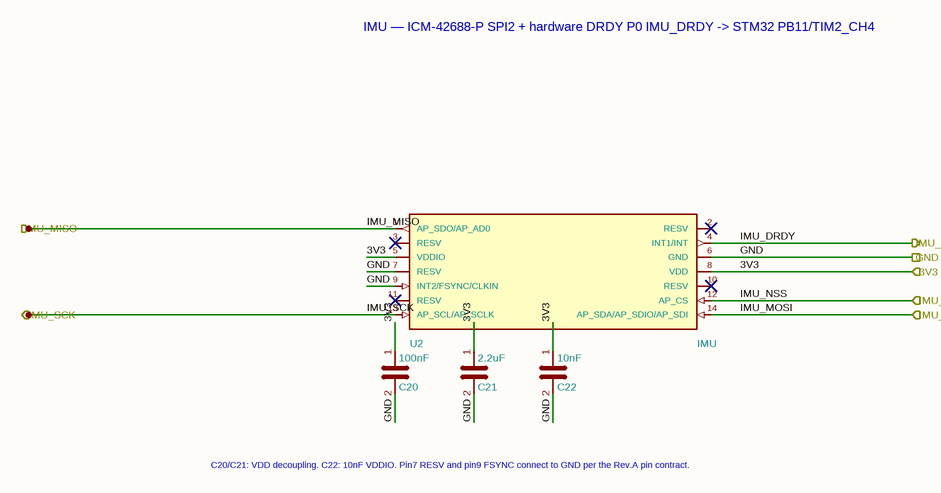
[diagram p6: 40_IMU.SchDoc]

### Parts
C20  100nF  [C_0402_1005Metric]
C21  2.2uF  [C_0603_1608Metric]
C22  10nF  [C_0402_1005Metric]
U2  IMU  [ICM-42688-P_LGA14_2.5x3mm_P0.5mm]

### Ports
3V3 (in), GND, IMU_DRDY (out), IMU_MISO (out), IMU_MOSI (in), IMU_NSS (in), IMU_SCK (in)

### Nets
3V3: C20.1 C21.1 C22.1 U2.5(VDDIO) U2.8(VDD) ; port 3V3
GND: C20.2 C21.2 C22.2 U2.6(GND) U2.7(RESV) U2.9(INT2/FSYNC/CLKIN) ; port GND
IMU_DRDY: U2.4(INT1/INT) ; port IMU_DRDY
IMU_MISO: U2.1(AP_SDO/AP_AD0) ; port IMU_MISO
IMU_MOSI: U2.14(AP_SDA/AP_SDIO/AP_SDI) ; port IMU_MOSI
IMU_NSS: U2.12(AP_CS) ; port IMU_NSS
IMU_SCK: U2.13(AP_SCL/AP_SCLK) ; port IMU_SCK

Not connected (* = marked no-connect by the designer): U2 2(RESV)* 3(RESV)* 10(RESV)* 11(RESV)*

### Notes on the sheet
- IMU — ICM-42688-P SPI2 + hardware DRDY
  P0 IMU_DRDY -> STM32 PB11/TIM2_CH4
- C20/C21: VDD decoupling. C22: 10nF VDDIO.
  Pin7 RESV and pin9 FSYNC connect to GND
  per the Rev.A pin contract.
- 1
- 2
- 3
- 4
- A
- B
- Title: EVT_SYS_CARRIER
- File: 40_IMU.kicad_sch
- Sheet: /
- C
- KiCad E.D.A.  kicad (5.1.4)-1
- Size: A5
- Date:
- Rev:
- Id: 1/1

### Library data of the parts
C20 = C: MPN: 100nF_6.3V_X7R; hierarchy_path: /66980d89-56fb-4772-93a7-06a61d388399/1152ce88-d77a-4f94-b3cb-08896bab9e7a; Value: 100nF; Footprint: Capacitor_SMD:C_0402_1005Metric
C21 = C: MPN: 2.2uF_6.3V_X7R; hierarchy_path: /66980d89-56fb-4772-93a7-06a61d388399/1152ce88-d77a-4f94-b3cb-08896bab9e7a; Value: 2.2uF; Footprint: Capacitor_SMD:C_0603_1608Metric
C22 = C: MPN: 10nF_6.3V_X7R; hierarchy_path: /66980d89-56fb-4772-93a7-06a61d388399/1152ce88-d77a-4f94-b3cb-08896bab9e7a; Value: 10nF; Footprint: Capacitor_SMD:C_0402_1005Metric
U2 = ICM-42688-P: Capture_Status: LOCAL_CONTRACT_SYMBOL; hierarchy_path: /66980d89-56fb-4772-93a7-06a61d388399/1152ce88-d77a-4f94-b3cb-08896bab9e7a; MPN: ICM-42688-P; Value: IMU; Footprint: SystemCarrier_Local:ICM-42688-P_LGA14_2.5x3mm_P0.5mm

## Sheet 50_RADAR_IO_CAN.SchDoc
size 209 x 148 mm
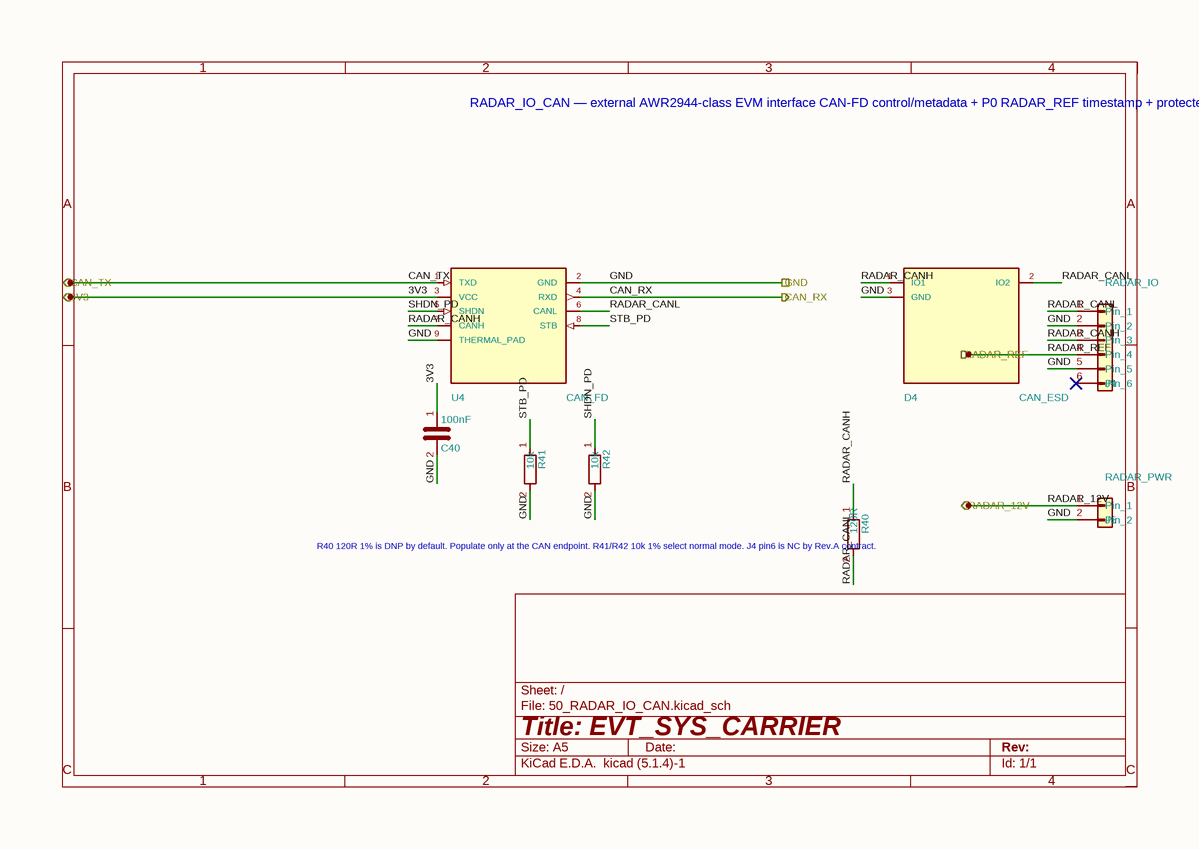
[diagram p7: 50_RADAR_IO_CAN.SchDoc]

### Parts
C40  100nF  [C_0402_1005Metric]
D4  CAN_ESD  [SOT-23]
J4  RADAR_IO  [Molex_43045-0600_RA_THT_6P]
J5  RADAR_PWR  [Molex_43650-0200_RA_THT_2P]
R40  120R  [R_0603_1608Metric]
R41  10k  [R_0603_1608Metric]
R42  10k  [R_0603_1608Metric]
U4  CAN_FD  [Texas_DRB0008A]

### Ports
3V3 (in), CAN_RX (out), CAN_TX (in), GND, RADAR_12V (in), RADAR_REF (out)

### Nets
3V3: C40.1 U4.3(VCC) ; port 3V3
CAN_RX: U4.4(RXD) ; port CAN_RX
CAN_TX: U4.1(TXD) ; port CAN_TX
GND: C40.2 D4.3(GND) J4.2(Pin_2) J4.5(Pin_5) J5.2(Pin_2) R41.2 R42.2 U4.2(GND) U4.9(THERMAL_PAD) ; port GND
RADAR_12V: J5.1(Pin_1) ; port RADAR_12V
RADAR_CANH: D4.1(IO1) J4.3(Pin_3) R40.1 U4.7(CANH)
RADAR_CANL: D4.2(IO2) J4.1(Pin_1) R40.2 U4.6(CANL)
RADAR_REF: J4.4(Pin_4) ; port RADAR_REF
SHDN_PD: R42.1 U4.5(SHDN)
STB_PD: R41.1 U4.8(STB)

Not connected (* = marked no-connect by the designer): J4 6(Pin_6)*

### Notes on the sheet
- RADAR_IO_CAN — external AWR2944-class EVM interface
  CAN-FD control/metadata + P0 RADAR_REF timestamp + protected 12V
- (near R40) R40 120R 1% is DNP by default.
  Populate only at the CAN endpoint.
  R41/R42 10k 1% select normal mode.
  J4 pin6 is NC by Rev.A contract.
- 1
- 2
- 3
- 4
- A
- B
- Title: EVT_SYS_CARRIER
- File: 50_RADAR_IO_CAN.kicad_sch
- Sheet: /
- C
- KiCad E.D.A.  kicad (5.1.4)-1
- Size: A5
- Date:
- Rev:
- Id: 1/1

### Library data of the parts
C40 = C: MPN: 100nF_6.3V_X7R; hierarchy_path: /66980d89-56fb-4772-93a7-06a61d388399/2b812d5a-90b0-498f-afec-462f55ab5efa; Value: 100nF; Footprint: Capacitor_SMD:C_0402_1005Metric
D4 = ESD2CANFD24DBZRQ1: Capture_Status: LOCAL_CONTRACT_SYMBOL; hierarchy_path: /66980d89-56fb-4772-93a7-06a61d388399/2b812d5a-90b0-498f-afec-462f55ab5efa; MPN: ESD2CANFD24DBZRQ1; Value: CAN_ESD; Footprint: Package_TO_SOT_SMD:SOT-23
J4 = Conn_01x06: MPN: 43045-0600; hierarchy_path: /66980d89-56fb-4772-93a7-06a61d388399/2b812d5a-90b0-498f-afec-462f55ab5efa; Value: RADAR_IO; Footprint: SystemCarrier_Altium:Molex_43045-0600_RA_THT_6P
J5 = Conn_01x02: MPN: 43650-0200; hierarchy_path: /66980d89-56fb-4772-93a7-06a61d388399/2b812d5a-90b0-498f-afec-462f55ab5efa; Value: RADAR_PWR; Footprint: SystemCarrier_Altium:Molex_43650-0200_RA_THT_2P
R40 = R: MPN: 120R_1%; hierarchy_path: /66980d89-56fb-4772-93a7-06a61d388399/2b812d5a-90b0-498f-afec-462f55ab5efa; Value: 120R; Footprint: Resistor_SMD:R_0603_1608Metric
R41 R42 = R: MPN: 10k_1%; hierarchy_path: /66980d89-56fb-4772-93a7-06a61d388399/2b812d5a-90b0-498f-afec-462f55ab5efa; Value: 10k; Footprint: Resistor_SMD:R_0603_1608Metric
U4 = TCAN3404DRBRQ1: Capture_Status: LOCAL_CONTRACT_SYMBOL; hierarchy_path: /66980d89-56fb-4772-93a7-06a61d388399/2b812d5a-90b0-498f-afec-462f55ab5efa; MPN: TCAN3404DRBRQ1; Value: CAN_FD; Footprint: Package_DFN_QFN:Texas_DRB0008A

## Sheet 60_HOST_UART.SchDoc
size 209 x 148 mm
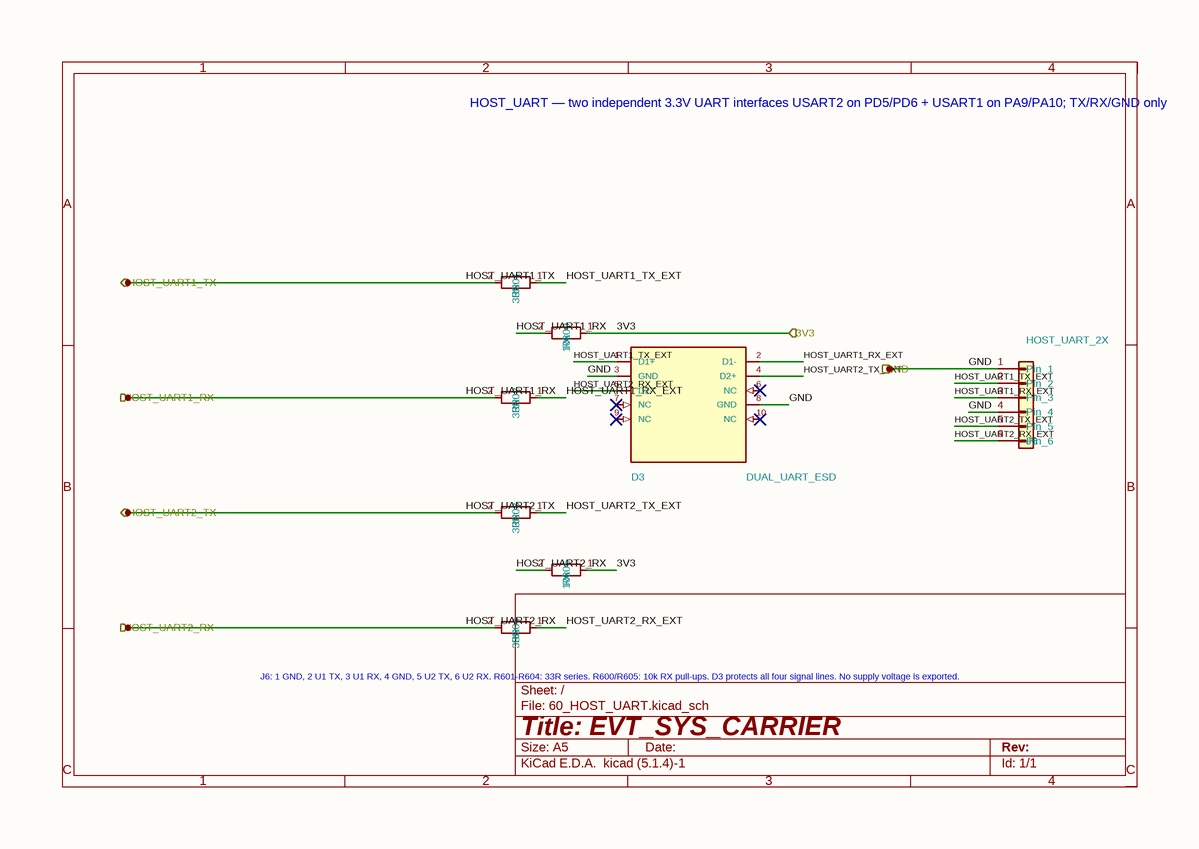
[diagram p8: 60_HOST_UART.SchDoc]

### Parts
D3  DUAL_UART_ESD  [USON-10_2.5x1.0mm_P0.5mm]
J6  HOST_UART_2X  [Molex_43045-0600_RA_THT_6P]
R600  10k  [R_0603_1608Metric]
R601  33R  [R_0402_1005Metric]
R602  33R  [R_0402_1005Metric]
R603  33R  [R_0402_1005Metric]
R604  33R  [R_0402_1005Metric]
R605  10k  [R_0603_1608Metric]

### Ports
3V3 (in), GND, HOST_UART1_RX (out), HOST_UART1_TX (in), HOST_UART2_RX (out), HOST_UART2_TX (in)

### Nets
3V3: R600.1 R605.1 ; port 3V3
GND: D3.3(GND) D3.8(GND) J6.1(Pin_1) J6.4(Pin_4) ; port GND
HOST_UART1_RX: R600.2 R602.2 ; port HOST_UART1_RX
HOST_UART1_RX_EXT: D3.2(D1-) J6.3(Pin_3) R602.1
HOST_UART1_TX: R601.2 ; port HOST_UART1_TX
HOST_UART1_TX_EXT: D3.1(D1+) J6.2(Pin_2) R601.1
HOST_UART2_RX: R604.2 R605.2 ; port HOST_UART2_RX
HOST_UART2_RX_EXT: D3.5(D2-) J6.6(Pin_6) R604.1
HOST_UART2_TX: R603.2 ; port HOST_UART2_TX
HOST_UART2_TX_EXT: D3.4(D2+) J6.5(Pin_5) R603.1

Not connected (* = marked no-connect by the designer): D3 6(NC)* 7(NC)* 9(NC)* 10(NC)*

### Notes on the sheet
- HOST_UART — two independent 3.3V UART interfaces
  USART2 on PD5/PD6 + USART1 on PA9/PA10; TX/RX/GND only
- (near R604) J6: 1 GND, 2 U1 TX, 3 U1 RX,
  4 GND, 5 U2 TX, 6 U2 RX.
  R601-R604: 33R series. R600/R605: 10k RX pull-ups.
  D3 protects all four signal lines.
  No supply voltage is exported.
- 1
- 2
- 3
- 4
- A
- B
- Title: EVT_SYS_CARRIER
- File: 60_HOST_UART.kicad_sch
- Sheet: /
- C
- KiCad E.D.A.  kicad (5.1.4)-1
- Size: A5
- Date:
- Rev:
- Id: 1/1

### Library data of the parts
D3 = TPD4E05U06DQAR: Capture_Status: LOCAL_CONTRACT_SYMBOL; hierarchy_path: /66980d89-56fb-4772-93a7-06a61d388399/8d70ae48-bcdc-481f-a052-a7c6b659cbf0; MPN: TPD4E05U06DQAR; Value: DUAL_UART_ESD; Footprint: Package_SON:USON-10_2.5x1.0mm_P0.5mm
J6 = Conn_01x06: MPN: 43045-0600; hierarchy_path: /66980d89-56fb-4772-93a7-06a61d388399/8d70ae48-bcdc-481f-a052-a7c6b659cbf0; Value: HOST_UART_2X; Footprint: SystemCarrier_Altium:Molex_43045-0600_RA_THT_6P
R600 R605 = R: MPN: 10k_1%; hierarchy_path: /66980d89-56fb-4772-93a7-06a61d388399/8d70ae48-bcdc-481f-a052-a7c6b659cbf0; Value: 10k; Footprint: Resistor_SMD:R_0603_1608Metric
R601-R604 = R: MPN: 33R_1%; hierarchy_path: /66980d89-56fb-4772-93a7-06a61d388399/8d70ae48-bcdc-481f-a052-a7c6b659cbf0; Value: 33R; Footprint: Resistor_SMD:R_0402_1005Metric

## Sheet 70_DEBUG_BOOT.SchDoc
size 209 x 148 mm
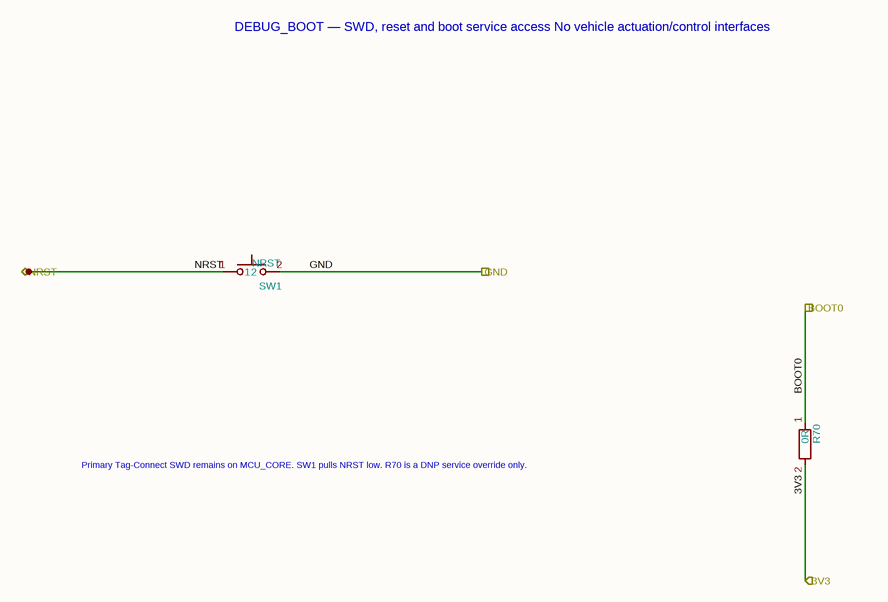
[diagram p9: 70_DEBUG_BOOT.SchDoc]

### Parts
R70  0R  [R_0603_1608Metric]
SW1  NRST  [ESwitch_TL3301_GullWing_6x6]

### Ports
3V3 (in), BOOT0, GND, NRST (bidir)

### Nets
3V3: R70.2 ; port 3V3
BOOT0: R70.1 ; port BOOT0
GND: SW1.2 ; port GND
NRST: SW1.1 ; port NRST

### Notes on the sheet
- DEBUG_BOOT — SWD, reset and boot service access
  No vehicle actuation/control interfaces
- Primary Tag-Connect SWD remains on MCU_CORE.
  SW1 pulls NRST low. R70 is a DNP
  service override only.
- 1
- 2
- 3
- 4
- A
- B
- Title: EVT_SYS_CARRIER
- File: 70_DEBUG_BOOT.kicad_sch
- Sheet: /
- C
- KiCad E.D.A.  kicad (5.1.4)-1
- Size: A5
- Date:
- Rev:
- Id: 1/1

### Library data of the parts
R70 = R: hierarchy_path: /66980d89-56fb-4772-93a7-06a61d388399/3686b07d-3d02-4fcb-be66-106e5ebdc9c7; MPN: 0R; Value: 0R; Footprint: Resistor_SMD:R_0603_1608Metric
SW1 = SW_Push: MPN: TL3301NF160QG; hierarchy_path: /66980d89-56fb-4772-93a7-06a61d388399/3686b07d-3d02-4fcb-be66-106e5ebdc9c7; Value: NRST; Footprint: SystemCarrier_Altium:ESwitch_TL3301_GullWing_6x6

## Nets that join several sheets
3V3: 10_POWER_INPUT (7 pins), 20_MCU_CORE (38 pins), 40_IMU (5 pins), 50_RADAR_IO_CAN (C40.1 U4.3), 60_HOST_UART (R600.1 R605.1), 70_DEBUG_BOOT (R70.2)
5V_GNSS: 10_POWER_INPUT (C91.1 L9.2 R90.2 U9.14), 30_TIME_GNSS (J8.1)
BOOT0: 20_MCU_CORE (R10.1 U1.166), 70_DEBUG_BOOT (R70.1)
CAN_RX: 20_MCU_CORE (U1.142), 50_RADAR_IO_CAN (U4.4)
CAN_TX: 20_MCU_CORE (U1.143), 50_RADAR_IO_CAN (U4.1)
GND: 10_POWER_INPUT (57 pins), 20_MCU_CORE (39 pins), 30_TIME_GNSS (D8.3 D8.8 J8.6), 40_IMU (6 pins), 50_RADAR_IO_CAN (9 pins), 60_HOST_UART (D3.3 D3.8 J6.1 J6.4), 70_DEBUG_BOOT (SW1.2)
GNSS_PPS: 20_MCU_CORE (U1.40), 30_TIME_GNSS (D8.4 J8.4)
GNSS_RX_EXT: 20_MCU_CORE (U1.96), 30_TIME_GNSS (D8.1 J8.2)
GNSS_TX_EXT: 20_MCU_CORE (U1.97), 30_TIME_GNSS (D8.2 J8.3)
HOST_UART1_RX: 20_MCU_CORE (TP2.1 U1.150), 60_HOST_UART (R600.2 R602.2)
HOST_UART1_TX: 20_MCU_CORE (TP1.1 U1.147), 60_HOST_UART (R601.2)
HOST_UART2_RX: 20_MCU_CORE (U1.121), 60_HOST_UART (R604.2 R605.2)
HOST_UART2_TX: 20_MCU_CORE (U1.120), 60_HOST_UART (R603.2)
IMU_DRDY: 20_MCU_CORE (U1.80), 40_IMU (U2.4)
IMU_MISO: 20_MCU_CORE (U1.94), 40_IMU (U2.1)
IMU_MOSI: 20_MCU_CORE (U1.95), 40_IMU (U2.14)
IMU_NSS: 20_MCU_CORE (U1.92), 40_IMU (U2.12)
IMU_SCK: 20_MCU_CORE (U1.93), 40_IMU (U2.13)
NRST: 20_MCU_CORE (C115.1 U1.31), 70_DEBUG_BOOT (SW1.1)
RADAR_12V: 10_POWER_INPUT (U7.6), 50_RADAR_IO_CAN (J5.1)
RADAR_EFUSE_FLT: 10_POWER_INPUT (R7F.1 U7.4), 20_MCU_CORE (U1.2)
RADAR_REF: 20_MCU_CORE (U1.79), 50_RADAR_IO_CAN (J4.4)
SYS_EFUSE_FLT: 10_POWER_INPUT (R6F.1 U6.14), 20_MCU_CORE (U1.1)